# Altium project QCMI_SOM8MM.PrjPcb (part 1 of 3)
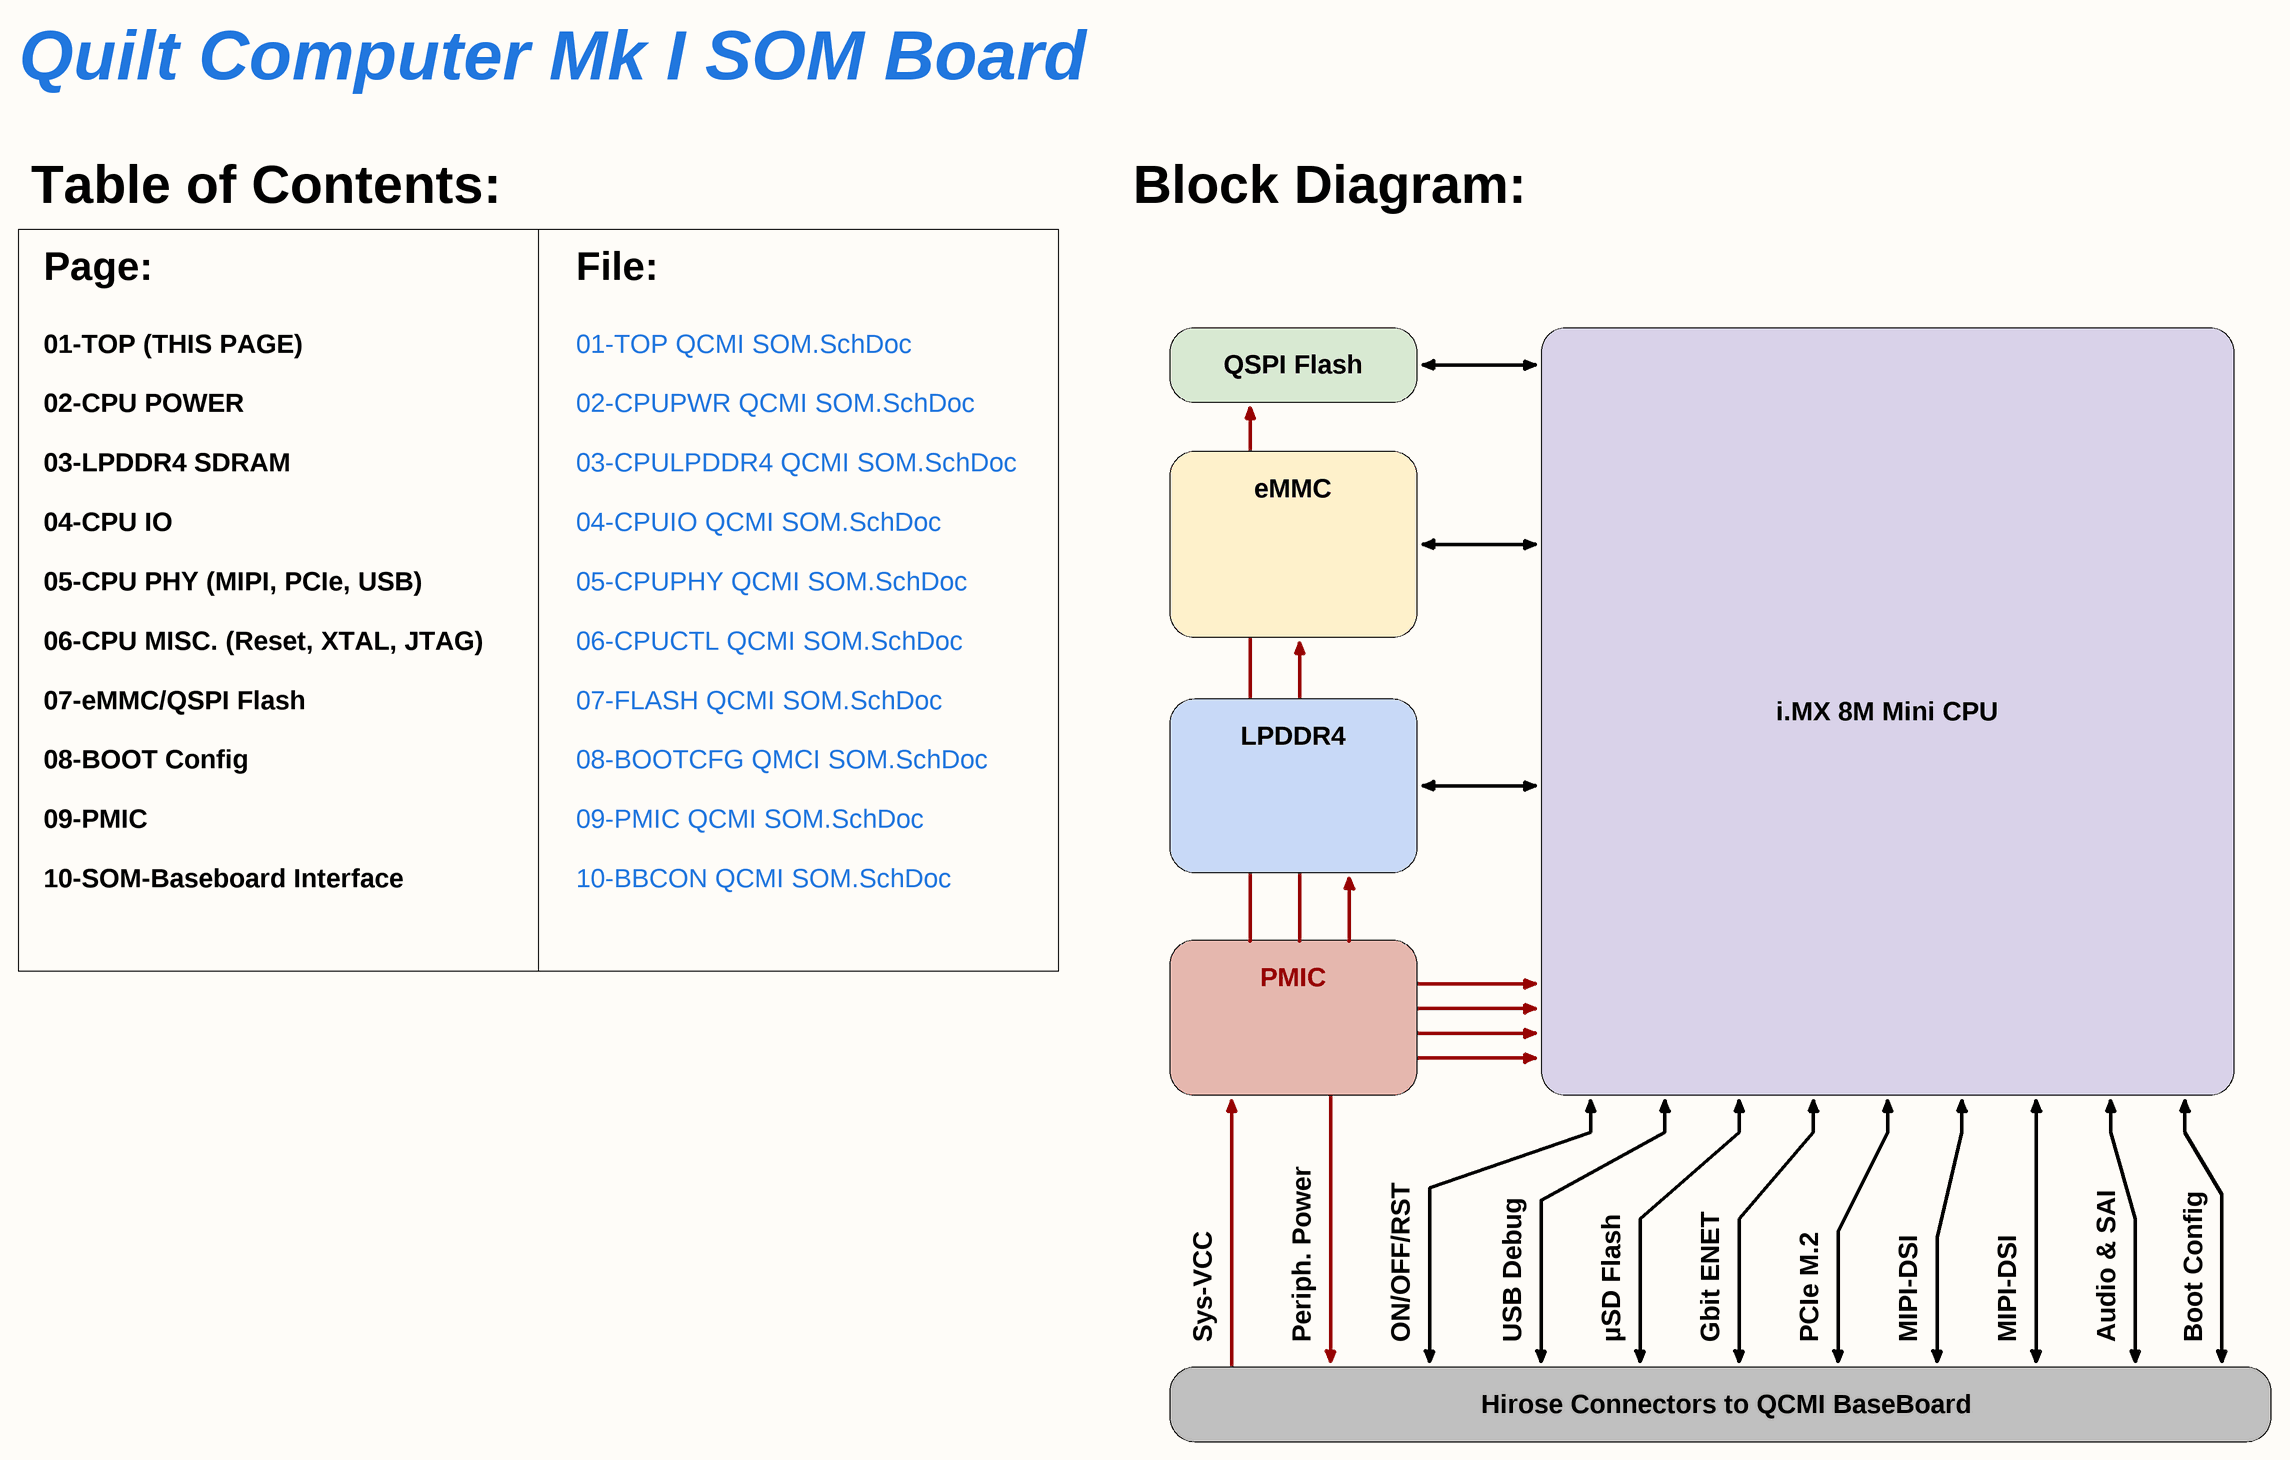
[diagram p0: 01-TOP QCMI SOM.SchDoc]
ProjectAddress1: 29315 Stonecrest Rd; ProjectAddress2: Rolling Hills Estates; ProjectAddress3: CA, 90275; ProjectAddress4: USA; ProjectApprover: S. Nesterenko; ProjectCAGE: 8LSW1; ProjectCompany: Allegro Labs, Inc.; ProjectDOC_NO_ASSY_DWG: TBD; ProjectDOC_NO_BOM: TBD; ProjectDOC_NO_FAB_DWG: TBD; ProjectDOC_NO_PCB_DWG: TBD; ProjectEngineer: B. Jordan; ProjectName: Quilt Computer Mk I SOM Board; ProjectNameShort: QCMISM; ProjectOrganization: QLTR; ProjectReviewer: D. Gudino; ProjectRevision: B
10 sheets, 227 parts. Net scope: global (net labels, ports and power ports of the same name join across sheets).
Board file: IMX8MMLPD4-CPU2_FULLY_PREPLACED_FANOUT.PcbDoc
Sheets:
  01-TOP QCMI SOM.SchDoc
  02-CPUPWR QCMI SOM.SchDoc
  03-CPULPDDR4 QCMI SOM.SchDoc
  04-CPUIO QCMI SOM.SchDoc
  05-CPUPHY QCMI SOM.SchDoc
  06-CPUCTL QCMI SOM.SchDoc
  07-FLASH QCMI SOM.SchDoc
  08-BOOTCFG QMCI SOM.SchDoc
  09-PMIC QCMI SOM.SchDoc
  10-BBCON QCMI SOM.SchDoc

## Sheet 01-TOP QCMI SOM.SchDoc: Title and Rev History
size 558 x 431 mm; CAGE_CODE: 8LSW1; Designer: B. Jordan; DsnPath: G:\My Drive\Quilter Computer - Engineering Assets\NXP i.MX8M-Mini\8MMINILPD4-CPU2-DESIGNFILES\8MMINILPD4-CPU2-DESIGNFILES\SCH-47712_A4.DSN; ApprovedBy: S. Nesterenko; CheckedBy: D. Gudino; Author: B. Jordan; CompanyName: Allegro Labs, Inc.; DrawnBy: B. Jordan; Engineer: B. Jordan; Address1: 29315 Stonecrest Rd; Address2: Rolling Hills Estates; Address3: CA, 90275; Address4: USA; DocumentNumber: QCMISM-SCH-01-0; Revision: 0; SheetNumber: 01; SheetTotal: 10; CHK_APP_DATE: --/--/--; DSN_APP_DATE: --/--/--; ENG_APP_DATE: --/--/--; DOC_NO_BOM: TBD; DOC_NO_ASSY_DWG: TBD; DOC_NO_FAB_DWG: TBD; DOC_NO_PCB_DWG: TBD

### Notes on the sheet
- Quilt Computer Mk I SOM Board
- Table of Contents:
- Block Diagram:
- Page:
- File:
- QSPI Flash
- eMMC
- LPDDR4
- i.MX 8M Mini CPU
- 01-TOP (THIS PAGE)
  02-CPU POWER
  03-LPDDR4 SDRAM
  04-CPU IO
  05-CPU PHY (MIPI, PCIe, USB)
  06-CPU MISC. (Reset, XTAL, JTAG)
  07-eMMC/QSPI Flash
  08-BOOT Config
  09-PMIC
  10-SOM-Baseboard Interface
- 01-TOP QCMI SOM.SchDoc
  02-CPUPWR QCMI SOM.SchDoc
  03-CPULPDDR4 QCMI SOM.SchDoc
  04-CPUIO QCMI SOM.SchDoc
  05-CPUPHY QCMI SOM.SchDoc
  06-CPUCTL QCMI SOM.SchDoc
  07-FLASH QCMI SOM.SchDoc
  08-BOOTCFG QMCI SOM.SchDoc
  09-PMIC QCMI SOM.SchDoc
  10-BBCON QCMI SOM.SchDoc
- PMIC
- Sys-VCC
- Periph. Power
- ON/OFF/RST
- USB Debug
- µSD Flash
- Gbit ENET
- PCIe M.2
- MIPI-DSI
- Audio & SAI
- Boot Config
- Hirose Connectors to QCMI BaseBoard
- DWG. NO.
- REV.
- SHT.
- REVISION
- DESCRIPTION
- DATE
- APPROVED
- ENG:
- DSN:
- APPROVALS
- PROJECT
- REFERENCE DOCUMENTS
- BOM:
- CHK:
- TITLE
- ASSY DWG:
- FAB DWG:
- PCB DWG:
- SIZE
- FILE NAME
- C
- SCHEMATIC DOCUMENT NUMBER
- SHEET
- OF
- REV

## Sheet 02-CPUPWR QCMI SOM.SchDoc: CPU PWR
size 558 x 431 mm; CAGE_CODE: 8LSW1; Designer: B. Jordan; DsnPath: G:\My Drive\Quilter Computer - Engineering Assets\NXP i.MX8M-Mini\8MMINILPD4-CPU2-DESIGNFILES\8MMINILPD4-CPU2-DESIGNFILES\SCH-47712_A4.DSN; ApprovedBy: S. Nesterenko; CheckedBy: D. Gudino; Author: B. Jordan; CompanyName: Allegro Labs, Inc.; DrawnBy: B. Jordan; Engineer: B. Jordan; Address1: 29315 Stonecrest Rd; Address2: Rolling Hills Estates; Address3: CA, 90275; Address4: USA; DocumentNumber: QCMISM-SCH-02-0; Revision: 0; SheetNumber: 02; SheetTotal: 10; CHK_APP_DATE: --/--/--; DSN_APP_DATE: --/--/--; ENG_APP_DATE: --/--/--; DOC_NO_BOM: TBD; DOC_NO_ASSY_DWG: TBD; DOC_NO_FAB_DWG: TBD; DOC_NO_PCB_DWG: TBD
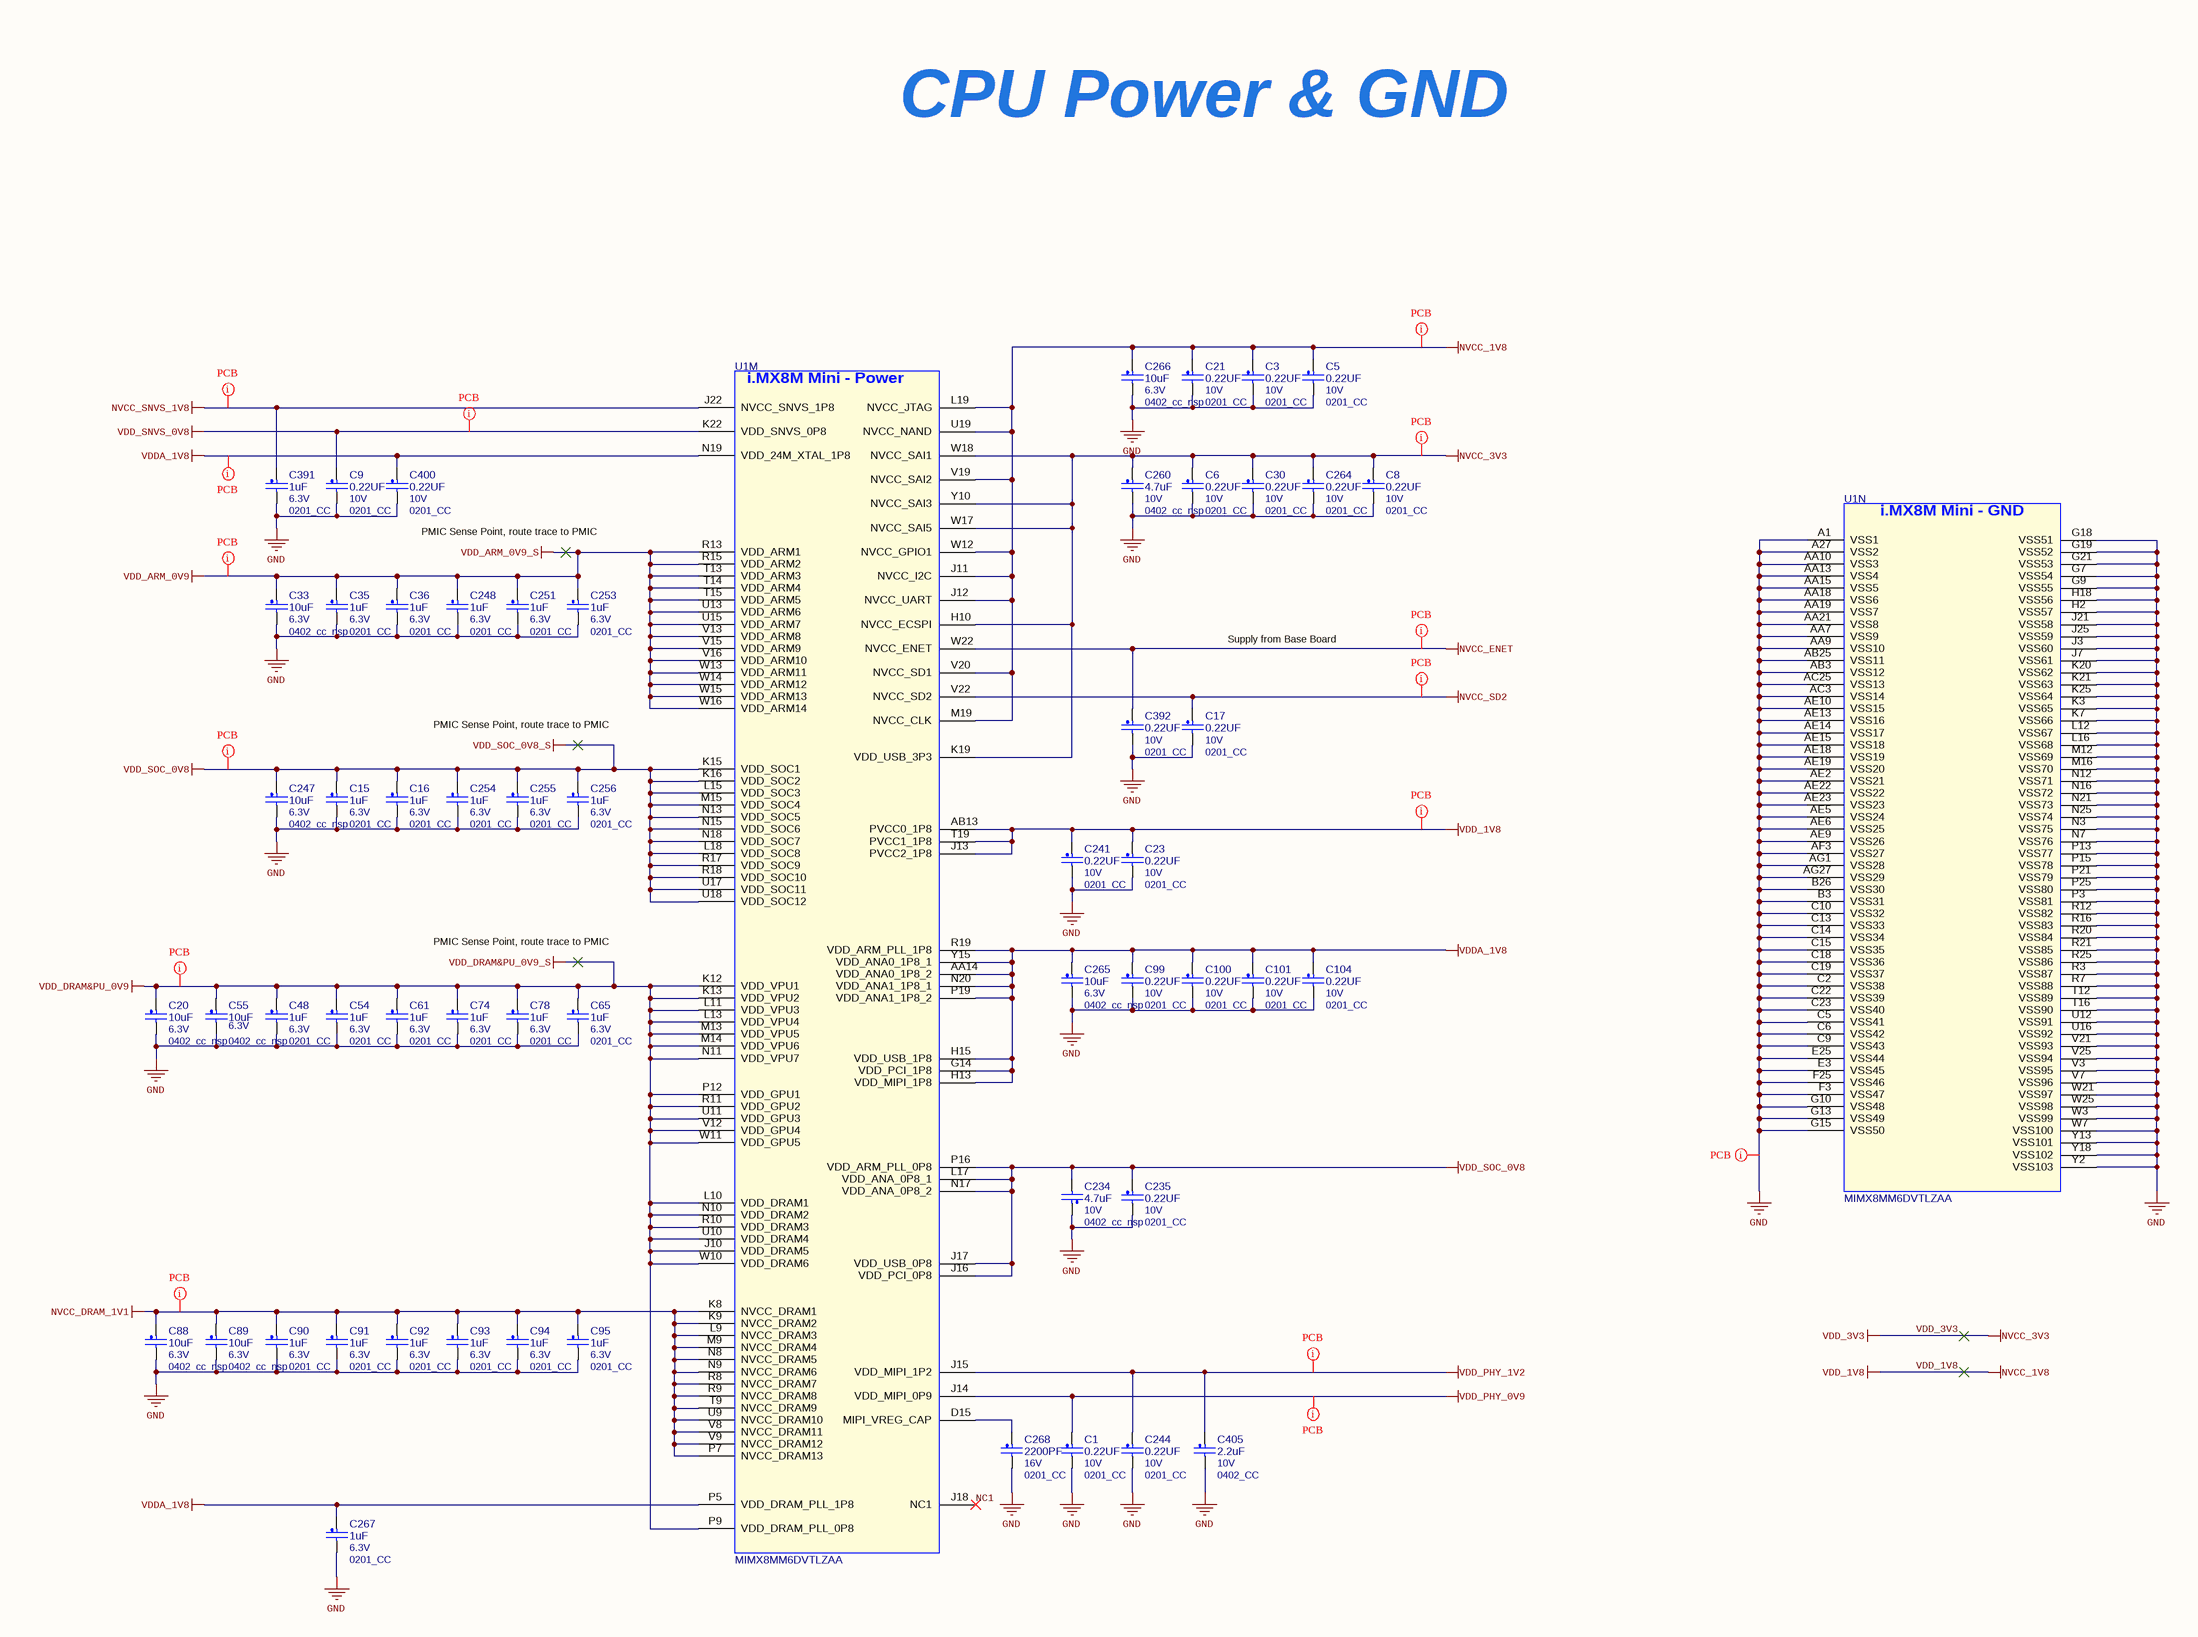
[diagram p1: 02-CPUPWR QCMI SOM.SchDoc]

### Parts
C1  0.22UF  VOLTAGE: 10V  [0201_CC]
C3  0.22UF  VOLTAGE: 10V  [0201_CC]
C5  0.22UF  VOLTAGE: 10V  [0201_CC]
C6  0.22UF  VOLTAGE: 10V  [0201_CC]
C8  0.22UF  VOLTAGE: 10V  [0201_CC]
C9  0.22UF  VOLTAGE: 10V  [0201_CC]
C15  1uF  VOLTAGE: 6.3V  [0201_CC]
C16  1uF  VOLTAGE: 6.3V  [0201_CC]
C17  0.22UF  VOLTAGE: 10V  [0201_CC]
C20  10uF  VOLTAGE: 6.3V  [0402_cc_nsp]
C21  0.22UF  VOLTAGE: 10V  [0201_CC]
C23  0.22UF  VOLTAGE: 10V  [0201_CC]
C30  0.22UF  VOLTAGE: 10V  [0201_CC]
C33  10uF  VOLTAGE: 6.3V  [0402_cc_nsp]
C35  1uF  VOLTAGE: 6.3V  [0201_CC]
C36  1uF  VOLTAGE: 6.3V  [0201_CC]
C48  1uF  VOLTAGE: 6.3V  [0201_CC]
C54  1uF  VOLTAGE: 6.3V  [0201_CC]
C55  10uF  VOLTAGE: 6.3V  [0402_cc_nsp]
C61  1uF  VOLTAGE: 6.3V  [0201_CC]
C65  1uF  VOLTAGE: 6.3V  [0201_CC]
C74  1uF  VOLTAGE: 6.3V  [0201_CC]
C78  1uF  VOLTAGE: 6.3V  [0201_CC]
C88  10uF  VOLTAGE: 6.3V  [0402_cc_nsp]
C89  10uF  VOLTAGE: 6.3V  [0402_cc_nsp]
C90  1uF  VOLTAGE: 6.3V  [0201_CC]
C91  1uF  VOLTAGE: 6.3V  [0201_CC]
C92  1uF  VOLTAGE: 6.3V  [0201_CC]
C93  1uF  VOLTAGE: 6.3V  [0201_CC]
C94  1uF  VOLTAGE: 6.3V  [0201_CC]
C95  1uF  VOLTAGE: 6.3V  [0201_CC]
C99  0.22UF  VOLTAGE: 10V  [0201_CC]
C100  0.22UF  VOLTAGE: 10V  [0201_CC]
C101  0.22UF  VOLTAGE: 10V  [0201_CC]
C104  0.22UF  VOLTAGE: 10V  [0201_CC]
C234  4.7uF  VOLTAGE: 10V  [0402_cc_nsp]
C235  0.22UF  VOLTAGE: 10V  [0201_CC]
C241  0.22UF  VOLTAGE: 10V  [0201_CC]
C244  0.22UF  VOLTAGE: 10V  [0201_CC]
C247  10uF  VOLTAGE: 6.3V  [0402_cc_nsp]
C248  1uF  VOLTAGE: 6.3V  [0201_CC]
C251  1uF  VOLTAGE: 6.3V  [0201_CC]
C253  1uF  VOLTAGE: 6.3V  [0201_CC]
C254  1uF  VOLTAGE: 6.3V  [0201_CC]
C255  1uF  VOLTAGE: 6.3V  [0201_CC]
C256  1uF  VOLTAGE: 6.3V  [0201_CC]
C260  4.7uF  VOLTAGE: 10V  [0402_cc_nsp]
C264  0.22UF  VOLTAGE: 10V  [0201_CC]
C265  10uF  VOLTAGE: 6.3V  [0402_cc_nsp]
C266  10uF  VOLTAGE: 6.3V  [0402_cc_nsp]
C267  1uF  VOLTAGE: 6.3V  [0201_CC]
C268  2200PF  VOLTAGE: 16V  [0201_CC]
C391  1uF  VOLTAGE: 6.3V  [0201_CC]
C392  0.22UF  VOLTAGE: 10V  [0201_CC]
C400  0.22UF  VOLTAGE: 10V  [0201_CC]
C405  2.2uF  VOLTAGE: 10V  [0402_CC]
U1  MIMX8MM6DVTLZAA  [bga486_0p5_14x14]  (parts M,N of 14)

### Nets
GND: C1.2 C3.2 C5.2 C6.2 C8.2 C9.2 C15.2 C16.2 C17.2 C20.2 C21.2 C23.2 C30.2 C33.2 C35.2 C36.2 C48.2 C54.2 C55.2 C61.2 C65.2 C74.2 C78.2 C88.2 C89.2 C90.2 C91.2 C92.2 C93.2 C94.2 C95.2 C99.2 C100.2 C101.2 C104.2 C234.1 C235.2 C241.2 C244.2 C247.2 C248.2 C251.2 C253.2 C254.2 C255.2 C256.2 C260.2 C264.2 C265.2 C266.2 C267.2 C268.2 C391.2 C392.2 C400.2 C405.2 U1.A1(VSS1) U1.A27(VSS2) U1.AA7(VSS9) U1.AA9(VSS10) U1.AA10(VSS3) U1.AA13(VSS4) U1.AA15(VSS5) U1.AA18(VSS6) U1.AA19(VSS7) U1.AA21(VSS8) U1.AB3(VSS12) U1.AB25(VSS11) U1.AC3(VSS14) U1.AC25(VSS13) U1.AE2(VSS21) U1.AE5(VSS24) U1.AE6(VSS25) U1.AE9(VSS26) U1.AE10(VSS15) U1.AE13(VSS16) U1.AE14(VSS17) U1.AE15(VSS18) U1.AE18(VSS19) U1.AE19(VSS20) U1.AE22(VSS22) U1.AE23(VSS23) U1.AF3(VSS27) U1.AG1(VSS28) U1.AG27(VSS29) U1.B3(VSS31) U1.B26(VSS30) U1.C2(VSS38) U1.C5(VSS41) U1.C6(VSS42) U1.C9(VSS43) U1.C10(VSS32) U1.C13(VSS33) U1.C14(VSS34) U1.C15(VSS35) U1.C18(VSS36) U1.C19(VSS37) U1.C22(VSS39) U1.C23(VSS40) U1.E3(VSS45) U1.E25(VSS44) U1.F3(VSS47) U1.F25(VSS46) U1.G7(VSS54) U1.G9(VSS55) U1.G10(VSS48) U1.G13(VSS49) U1.G15(VSS50) U1.G18(VSS51) U1.G19(VSS52) U1.G21(VSS53) U1.H2(VSS57) U1.H18(VSS56) U1.J3(VSS60) U1.J7(VSS61) U1.J21(VSS58) U1.J25(VSS59) U1.K3(VSS65) U1.K7(VSS66) U1.K20(VSS62) U1.K21(VSS63) U1.K25(VSS64) U1.L12(VSS67) U1.L16(VSS68) U1.M12(VSS69) U1.M16(VSS70) U1.N3(VSS75) U1.N7(VSS76) U1.N12(VSS71) U1.N16(VSS72) U1.N21(VSS73) U1.N25(VSS74) U1.P3(VSS81) U1.P13(VSS77) U1.P15(VSS78) U1.P21(VSS79) U1.P25(VSS80) U1.R3(VSS87) U1.R7(VSS88) U1.R12(VSS82) U1.R16(VSS83) U1.R20(VSS84) U1.R21(VSS85) U1.R25(VSS86) U1.T12(VSS89) U1.T16(VSS90) U1.U12(VSS91) U1.U16(VSS92) U1.V3(VSS95) U1.V7(VSS96) U1.V21(VSS93) U1.V25(VSS94) U1.W3(VSS99) U1.W7(VSS100) U1.W21(VSS97) U1.W25(VSS98) U1.Y2(VSS103) U1.Y13(VSS101) U1.Y18(VSS102)
NVCC_DRAM_1V1: C88.1 C89.1 C90.1 C91.1 C92.1 C93.1 C94.1 C95.1 U1.K8(NVCC_DRAM1) U1.K9(NVCC_DRAM2) U1.L9(NVCC_DRAM3) U1.M9(NVCC_DRAM4) U1.N8(NVCC_DRAM5) U1.N9(NVCC_DRAM6) U1.P7(NVCC_DRAM13) U1.R8(NVCC_DRAM7) U1.R9(NVCC_DRAM8) U1.T9(NVCC_DRAM9) U1.U9(NVCC_DRAM10) U1.V8(NVCC_DRAM11) U1.V9(NVCC_DRAM12)
NVCC_ENET: C392.1 U1.W22(NVCC_ENET)
NVCC_SD2: C17.1 U1.V22(NVCC_SD2)
NVCC_SNVS_1V8: C391.1 U1.J22(NVCC_SNVS_1P8)
VDD_1V8: C3.1 C5.1 C21.1 C23.1 C241.1 C266.1 U1.AB13(PVCC0_1P8) U1.J11(NVCC_I2C) U1.J12(NVCC_UART) U1.J13(PVCC2_1P8) U1.L19(NVCC_JTAG) U1.M19(NVCC_CLK) U1.T19(PVCC1_1P8) U1.U19(NVCC_NAND) U1.V19(NVCC_SAI2) U1.V20(NVCC_SD1) U1.W12(NVCC_GPIO1)  [also labelled NVCC_1V8]
VDD_3V3: C6.1 C8.1 C30.1 C260.1 C264.1 U1.H10(NVCC_ECSPI) U1.K19(VDD_USB_3P3) U1.W17(NVCC_SAI5) U1.W18(NVCC_SAI1) U1.Y10(NVCC_SAI3)  [also labelled NVCC_3V3]
VDD_ARM_0V9: C33.1 C35.1 C36.1 C248.1 C251.1 C253.1 U1.R13(VDD_ARM1) U1.R15(VDD_ARM2) U1.T13(VDD_ARM3) U1.T14(VDD_ARM4) U1.T15(VDD_ARM5) U1.U13(VDD_ARM6) U1.U15(VDD_ARM7) U1.V13(VDD_ARM8) U1.V15(VDD_ARM9) U1.V16(VDD_ARM10) U1.W13(VDD_ARM11) U1.W14(VDD_ARM12) U1.W15(VDD_ARM13) U1.W16(VDD_ARM14)  [also labelled VDD_ARM_0V9_S]
VDD_DRAM&PU_0V9: C20.1 C48.1 C54.1 C55.1 C61.1 C65.1 C74.1 C78.1 U1.J10(VDD_DRAM5) U1.K12(VDD_VPU1) U1.K13(VDD_VPU2) U1.L10(VDD_DRAM1) U1.L11(VDD_VPU3) U1.L13(VDD_VPU4) U1.M13(VDD_VPU5) U1.M14(VDD_VPU6) U1.N10(VDD_DRAM2) U1.N11(VDD_VPU7) U1.P9(VDD_DRAM_PLL_0P8) U1.P12(VDD_GPU1) U1.R10(VDD_DRAM3) U1.R11(VDD_GPU2) U1.U10(VDD_DRAM4) U1.U11(VDD_GPU3) U1.V12(VDD_GPU4) U1.W10(VDD_DRAM6) U1.W11(VDD_GPU5)  [also labelled VDD_DRAM&PU_0V9_S]
VDD_PHY_0V9: C1.1 U1.J14(VDD_MIPI_0P9)
VDD_PHY_1V2: C244.1 C405.1 U1.J15(VDD_MIPI_1P2)
VDD_SNVS_0V8: C9.1 U1.K22(VDD_SNVS_0P8)
VDD_SOC_0V8: C15.1 C16.1 C234.2 C235.1 C247.1 C254.1 C255.1 C256.1 U1.J16(VDD_PCI_0P8) U1.J17(VDD_USB_0P8) U1.K15(VDD_SOC1) U1.K16(VDD_SOC2) U1.L15(VDD_SOC3) U1.L17(VDD_ANA_0P8_1) U1.L18(VDD_SOC8) U1.M15(VDD_SOC4) U1.N13(VDD_SOC5) U1.N15(VDD_SOC6) U1.N17(VDD_ANA_0P8_2) U1.N18(VDD_SOC7) U1.P16(VDD_ARM_PLL_0P8) U1.R17(VDD_SOC9) U1.R18(VDD_SOC10) U1.U17(VDD_SOC11) U1.U18(VDD_SOC12)  [also labelled VDD_SOC_0V8_S]
VDDA_1V8: C99.1 C100.1 C101.1 C104.1 C265.1 C267.1 C400.1 U1.AA14(VDD_ANA0_1P8_2) U1.G14(VDD_PCI_1P8) U1.H13(VDD_MIPI_1P8) U1.H15(VDD_USB_1P8) U1.N19(VDD_24M_XTAL_1P8) U1.N20(VDD_ANA1_1P8_1) U1.P5(VDD_DRAM_PLL_1P8) U1.P19(VDD_ANA1_1P8_2) U1.R19(VDD_ARM_PLL_1P8) U1.Y15(VDD_ANA0_1P8_1)
NC1: U1.J18(NC1)
NetC268_1: C268.1 U1.D15(MIPI_VREG_CAP)

### Layout directives
rule Supply Nets [Voltage = 1.800]; net class POWER: NVCC_SNVS_1V8, VDD_1V8, VDDA_1V8
rule Supply Nets [Voltage = 800.0m]; net class POWER: VDD_SNVS_0V8, VDD_SOC_0V8
rule Supply Nets [Voltage = 900.0m]; net class POWER: VDD_ARM_0V9, VDD_DRAM&PU_0V9, VDD_PHY_0V9
rule Supply Nets [Voltage = 1.100]; net class POWER: NVCC_DRAM_1V1
rule Supply Nets [Voltage = 1.200]; net class POWER: VDD_PHY_1V2
rule Supply Nets [Voltage = 3.300]; net class POWER: NVCC_ENET, NVCC_SD2, VDD_3V3
mark named PCB: VDD_1V8
rule Supply Nets [Voltage = 0.000]; net class POWER: GND

### Notes on the sheet
- CPU Power & GND
- PMIC Sense Point, route trace to PMIC
- Supply from Base Board
- DWG. NO.
- REV.
- SHT.
- REVISION
- DESCRIPTION
- DATE
- APPROVED
- ENG:
- DSN:
- APPROVALS
- PROJECT
- REFERENCE DOCUMENTS
- BOM:
- CHK:
- TITLE
- ASSY DWG:
- FAB DWG:
- PCB DWG:
- SIZE
- FILE NAME
- C
- SCHEMATIC DOCUMENT NUMBER
- SHEET
- OF
- REV
- (in symbol MIMX8MM_BGA486P, part M) i.MX8M Mini - Power
- (in symbol MIMX8MM_BGA486P, part N) i.MX8M Mini - GND

### Library data of the parts
C1 C3 C9 C17 C100 C104 C235 C400 = CAP_NP: CAP CER 0.22UF 10V 20% X5R 0201; MFG_PN01: LMK063BJ224MP-F; MFG_NAME01: Taiyo Yuden; EIA Case: 0201; Temp Range: -55°C ~ 125°C; Value: 0.22UF; PCB Footprint: 0201_CC; ROHS: Yes; Tolerance: 20%
C5 C6 C8 C21 C23 C30 C99 C101 C241 C244 C264 C392 = CAP_NP: CAP CER 0.22UF 10V 20% X5R 0201; MFG_NAME01: Taiyo Yuden; MFG_PN01: LMK063BJ224MP-F; EIA Case: 0201; Temp Range: -55°C ~ 125°C; Value: 0.22UF; Tolerance: 20%; ROHS: Yes; PCB Footprint: 0201_CC
C15 C16 C35 C36 C48 C61 C65 C78 C90-C92 C95 C248 C251 C253 C254 C256 C391 = CAP_NP: CAP CER 1uF 6.3V 20% X5R 0201; Temp Range: -55°C ~ 125°C; EIA Case: 0201; MFG_PN01: 02016D105MAT2A; MFG_NAME01: AVX; Value: 1uF; ROHS: Yes; Tolerance: 20%; PCB Footprint: 0201_CC
C20 C88 C247 = CAP_NP: CAP CER 10UF 6.3V 20% X5R 0402; Temp Range: -55°C ~ 125°C; EIA Case: 0402; MFG_NAME01: SAMSUNG ELECTRO MECHANICS; MFG_PN01: CL05A106MQ5NUNC; Value: 10uF; PCB Footprint: 0402_cc_nsp; Tolerance: 20%; ROHS: Yes
C33 C55 C89 C265 C266 = CAP_NP: CAP CER 10UF 6.3V 20% X5R 0402; Temp Range: -55°C ~ 125°C; EIA Case: 0402; MFG_PN01: CL05A106MQ5NUNC; MFG_NAME01: SAMSUNG ELECTRO MECHANICS; Value: 10uF; PCB Footprint: 0402_cc_nsp; ROHS: Yes; Tolerance: 20%
C54 C74 C93 C94 C255 C267 = CAP_NP: CAP CER 1uF 6.3V 20% X5R 0201; Temp Range: -55°C ~ 125°C; EIA Case: 0201; MFG_NAME01: AVX; MFG_PN01: 02016D105MAT2A; Value: 1uF; PCB Footprint: 0201_CC; Tolerance: 20%; ROHS: Yes
C234 = CAP_NP: CAP CER 4.7uF 10V 10% X5R 0402; MFG_PN01: CL05A475KP5NRNC; MFG_NAME01: SAMSUNG ELECTRO MECHANICS; EIA Case: 0402; Temp Range: -55°C ~ 125°C; Value: 4.7uF; PCB Footprint: 0402_cc_nsp; ROHS: Yes; Tolerance: 10%
C260 = CAP_NP: CAP CER 4.7uF 10V 10% X5R 0402; Temp Range: -55°C ~ 125°C; EIA Case: 0402; MFG_PN01: CL05A475KP5NRNC; MFG_NAME01: SAMSUNG ELECTRO MECHANICS; Value: 4.7uF; PCB Footprint: 0402_cc_nsp; ROHS: Yes; Tolerance: 10%
C268 = CAP_NP: CAP CER 2200PF 16V 10% X7R 0201; MFG_PN01: GRM033R71C222KA88D; MFG_NAME01: MURATA; Tolerance: 20%; EIA Case: 0201; Temp Range: -55°C ~ 125°C; Value: 2200PF; ROHS: Yes; PCB Footprint: 0201_CC
C405 = CAP_NP: CAP CER 2.2uF 10V 10% X5R 0402; Temp Range: -55°C ~ 125°C; EIA Case: 0402; MFG_PN01: C1005X5R1A225K; MFG_NAME01: TDK; Value: 2.2uF; ROHS: Yes; Tolerance: 10%; PCB Footprint: 0402_CC
U1 = MIMX8MM_BGA486P: IC CPU QUAD CORTEX A53+M4 1.8GHZ BGA486; MFG_NAME01: NXP SEMICONDUCTORS; Value: MIMX8MM6DVTLZAA; MFG_PN01: MIMX8MM6DVTLZAA; ROHS: Yes; PCB Footprint: bga486_0p5_14x14; JEDEC Case: BGA486

## Sheet 03-CPULPDDR4 QCMI SOM.SchDoc: LPDDR4
size 558 x 431 mm; CAGE_CODE: 8LSW1; Designer: B. Jordan; DsnPath: G:\My Drive\Quilter Computer - Engineering Assets\NXP i.MX8M-Mini\8MMINILPD4-CPU2-DESIGNFILES\8MMINILPD4-CPU2-DESIGNFILES\SCH-47712_A4.DSN; ApprovedBy: S. Nesterenko; CheckedBy: D. Gudino; Author: B. Jordan; CompanyName: Allegro Labs, Inc.; DrawnBy: B. Jordan; Engineer: B. Jordan; Address1: 29315 Stonecrest Rd; Address2: Rolling Hills Estates; Address3: CA, 90275; Address4: USA; DocumentNumber: QCMISM-SCH-03-0; Revision: 0; SheetNumber: 03; SheetTotal: 10; CHK_APP_DATE: --/--/--; DSN_APP_DATE: --/--/--; ENG_APP_DATE: --/--/--; DOC_NO_BOM: TBD; DOC_NO_ASSY_DWG: TBD; DOC_NO_FAB_DWG: TBD; DOC_NO_PCB_DWG: TBD
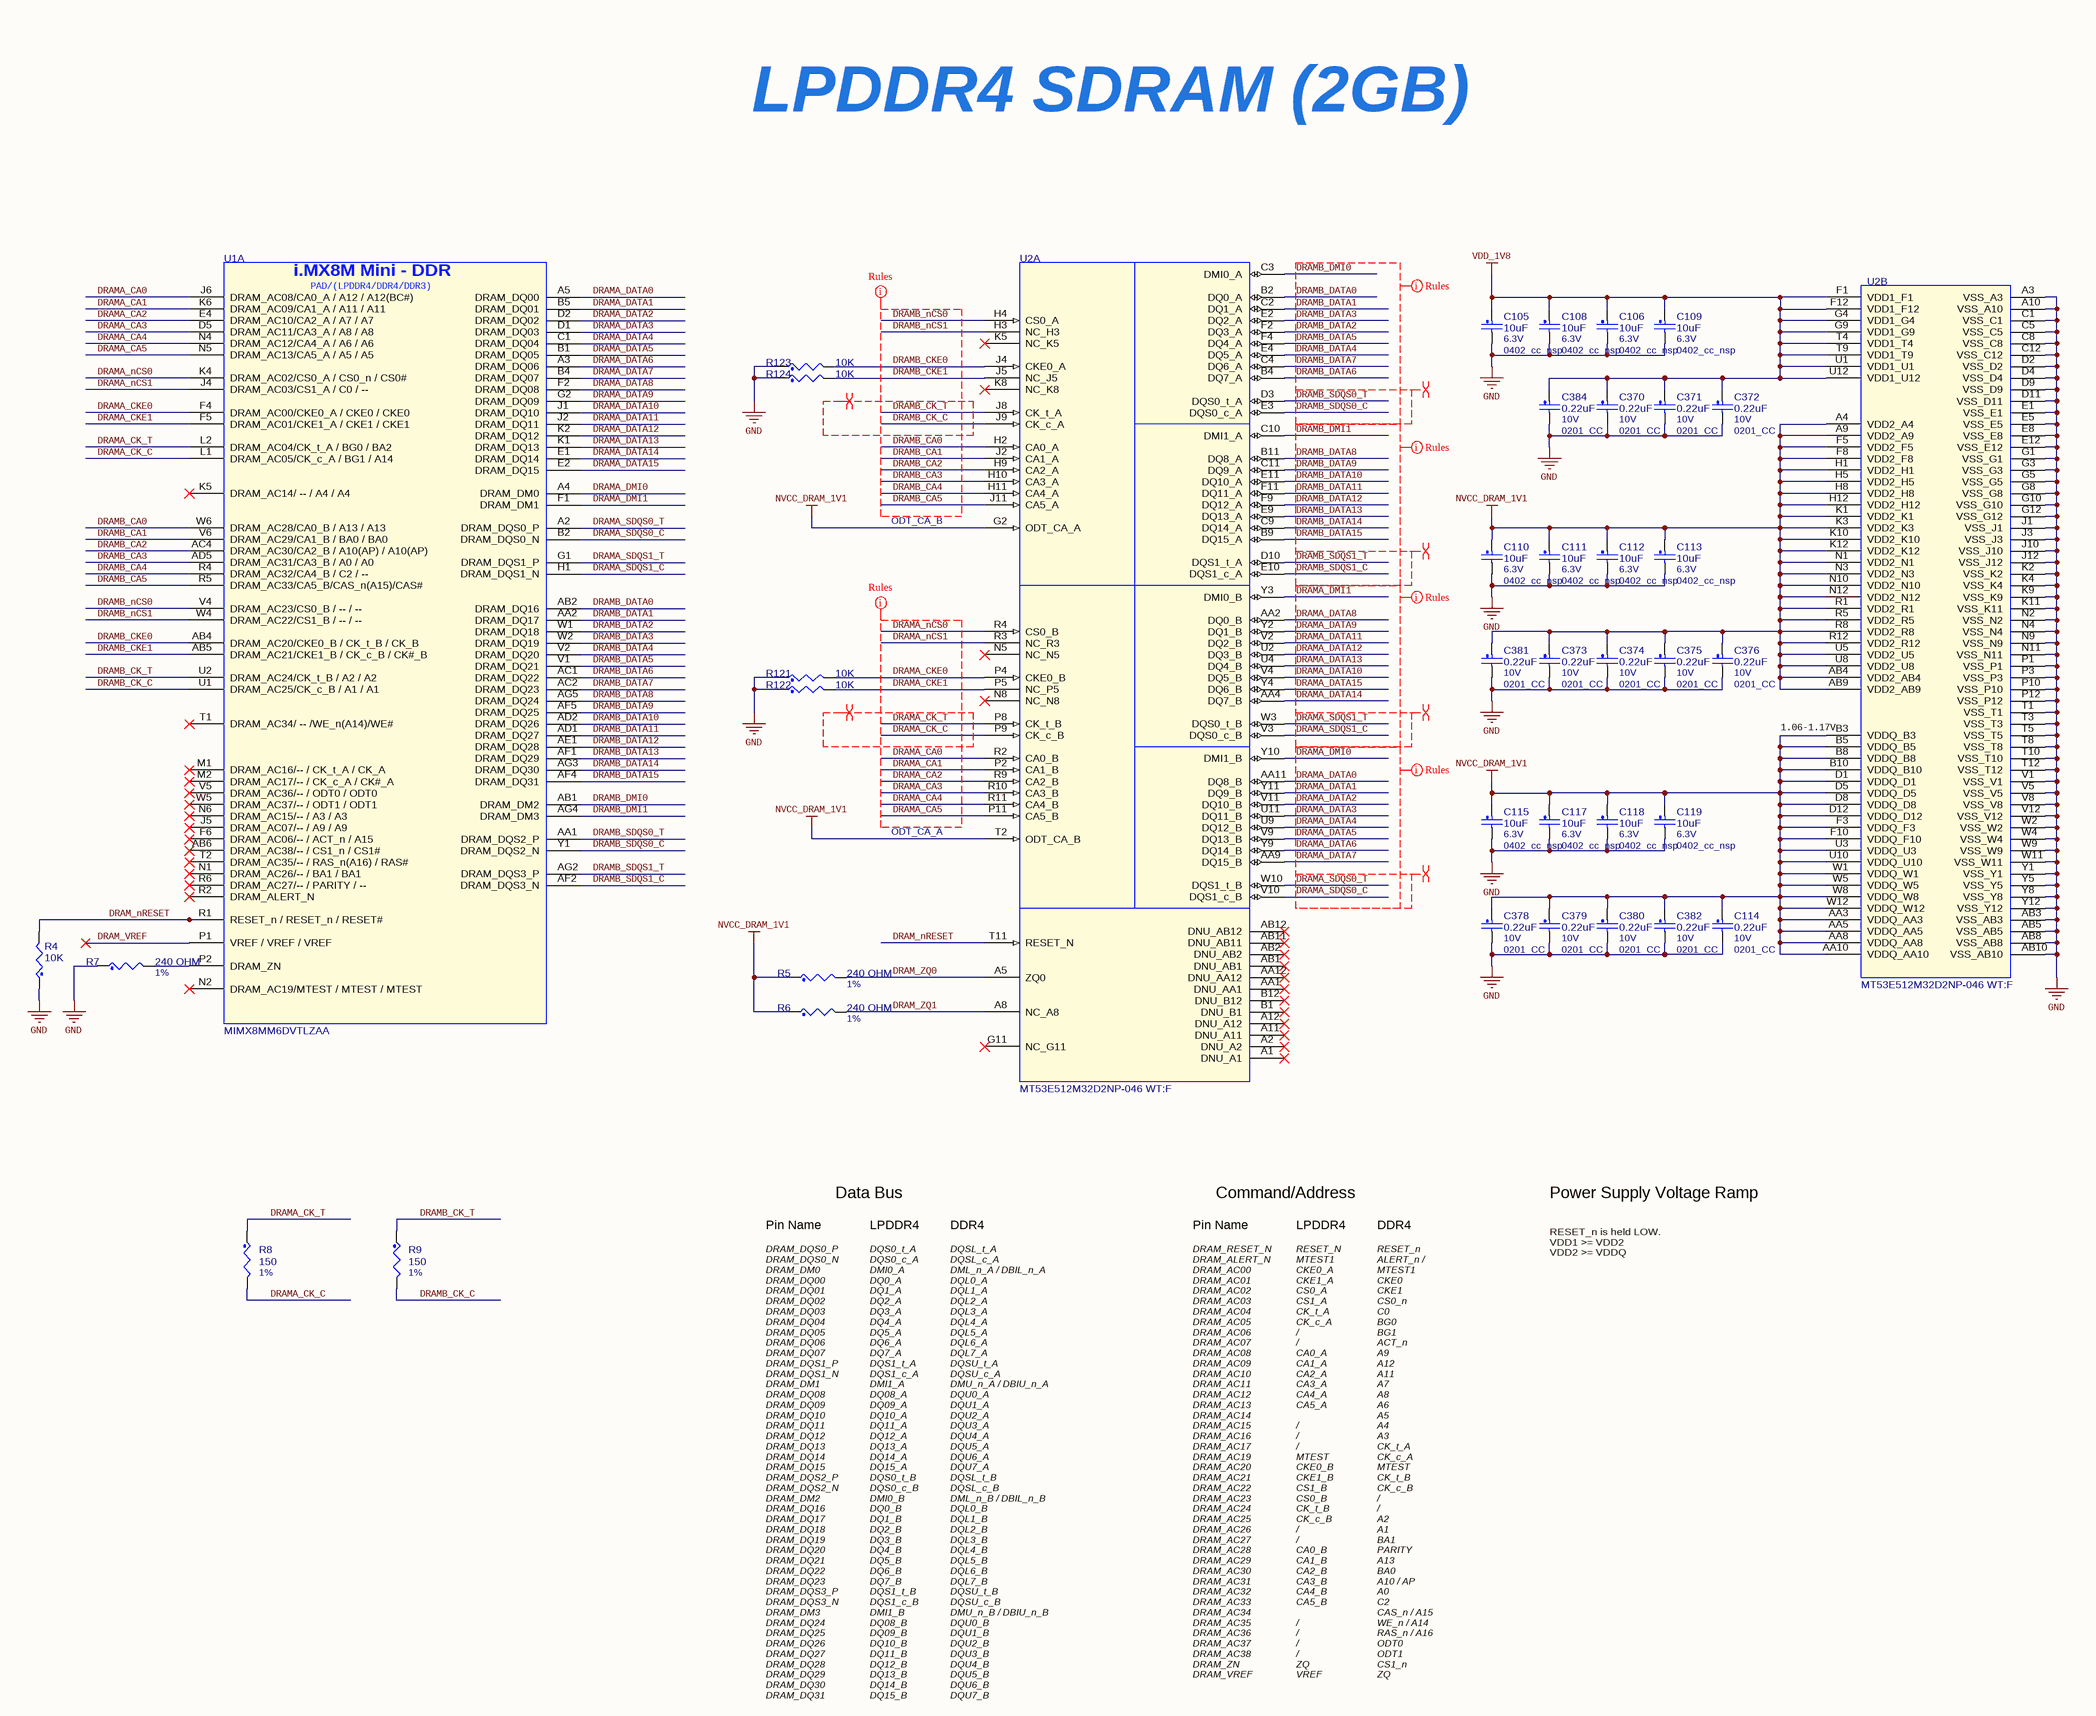
[diagram p2: 03-CPULPDDR4 QCMI SOM.SchDoc]

### Parts
C105  10uF  VOLTAGE: 6.3V  [0402_cc_nsp]
C106  10uF  VOLTAGE: 6.3V  [0402_cc_nsp]
C108  10uF  VOLTAGE: 6.3V  [0402_cc_nsp]
C109  10uF  VOLTAGE: 6.3V  [0402_cc_nsp]
C110  10uF  VOLTAGE: 6.3V  [0402_cc_nsp]
C111  10uF  VOLTAGE: 6.3V  [0402_cc_nsp]
C112  10uF  VOLTAGE: 6.3V  [0402_cc_nsp]
C113  10uF  VOLTAGE: 6.3V  [0402_cc_nsp]
C114  0.22uF  VOLTAGE: 10V  [0201_CC]
C115  10uF  VOLTAGE: 6.3V  [0402_cc_nsp]
C117  10uF  VOLTAGE: 6.3V  [0402_cc_nsp]
C118  10uF  VOLTAGE: 6.3V  [0402_cc_nsp]
C119  10uF  VOLTAGE: 6.3V  [0402_cc_nsp]
C370  0.22uF  VOLTAGE: 10V  [0201_CC]
C371  0.22uF  VOLTAGE: 10V  [0201_CC]
C372  0.22uF  VOLTAGE: 10V  [0201_CC]
C373  0.22uF  VOLTAGE: 10V  [0201_CC]
C374  0.22uF  VOLTAGE: 10V  [0201_CC]
C375  0.22uF  VOLTAGE: 10V  [0201_CC]
C376  0.22uF  VOLTAGE: 10V  [0201_CC]
C378  0.22uF  VOLTAGE: 10V  [0201_CC]
C379  0.22uF  VOLTAGE: 10V  [0201_CC]
C380  0.22uF  VOLTAGE: 10V  [0201_CC]
C381  0.22uF  VOLTAGE: 10V  [0201_CC]
C382  0.22uF  VOLTAGE: 10V  [0201_CC]
C384  0.22uF  VOLTAGE: 10V  [0201_CC]
R4  10K  [0201_CC]
R5  240 OHM  Tolerance: 1%  [0201_CC]
R6  240 OHM  Tolerance: 1%  [0201_CC]
R7  240 OHM  Tolerance: 1%  [0201_CC]
R8  150  Tolerance: 1%  [0402_CC]
R9  150  Tolerance: 1%  [0402_CC]
R121  10K  [0201_CC]
R122  10K  [0201_CC]
R123  10K  [0201_CC]
R124  10K  [0201_CC]
U1  MIMX8MM6DVTLZAA  [bga486_0p5_14x14]  (part A of 14)
U2  MT53E512M32D2NP-046 WT:F  [bga200_0p65x0p8_10p1x14p6]  (parts A,B of 2)

### Nets
GND: C105.2 C106.2 C108.2 C109.2 C110.2 C111.2 C112.2 C113.2 C114.2 C115.2 C117.2 C118.2 C119.2 C370.2 C371.2 C372.2 C373.2 C374.2 C375.2 C376.2 C378.2 C379.2 C380.2 C381.2 C382.2 C384.2 R4.1 R7.1 R121.1 R122.1 R123.1 R124.1 U2.A3(VSS_A3) U2.A10(VSS_A10) U2.AB3(VSS_AB3) U2.AB5(VSS_AB5) U2.AB8(VSS_AB8) U2.AB10(VSS_AB10) U2.C1(VSS_C1) U2.C5(VSS_C5) U2.C8(VSS_C8) U2.C12(VSS_C12) U2.D2(VSS_D2) U2.D4(VSS_D4) U2.D9(VSS_D9) U2.D11(VSS_D11) U2.E1(VSS_E1) U2.E5(VSS_E5) U2.E8(VSS_E8) U2.E12(VSS_E12) U2.G1(VSS_G1) U2.G3(VSS_G3) U2.G5(VSS_G5) U2.G8(VSS_G8) U2.G10(VSS_G10) U2.G12(VSS_G12) U2.J1(VSS_J1) U2.J3(VSS_J3) U2.J10(VSS_J10) U2.J12(VSS_J12) U2.K2(VSS_K2) U2.K4(VSS_K4) U2.K9(VSS_K9) U2.K11(VSS_K11) U2.N2(VSS_N2) U2.N4(VSS_N4) U2.N9(VSS_N9) U2.N11(VSS_N11) U2.P1(VSS_P1) U2.P3(VSS_P3) U2.P10(VSS_P10) U2.P12(VSS_P12) U2.T1(VSS_T1) U2.T3(VSS_T3) U2.T5(VSS_T5) U2.T8(VSS_T8) U2.T10(VSS_T10) U2.T12(VSS_T12) U2.V1(VSS_V1) U2.V5(VSS_V5) U2.V8(VSS_V8) U2.V12(VSS_V12) U2.W2(VSS_W2) U2.W4(VSS_W4) U2.W9(VSS_W9) U2.W11(VSS_W11) U2.Y1(VSS_Y1) U2.Y5(VSS_Y5) U2.Y8(VSS_Y8) U2.Y12(VSS_Y12)
NVCC_DRAM_1V1: C110.1 C111.1 C112.1 C113.1 C114.1 C115.1 C117.1 C118.1 C119.1 C373.1 C374.1 C375.1 C376.1 C378.1 C379.1 C380.1 C381.1 C382.1 R5.1 R6.1 U2.A4(VDD2_A4) U2.A9(VDD2_A9) U2.AA3(VDDQ_AA3) U2.AA5(VDDQ_AA5) U2.AA8(VDDQ_AA8) U2.AA10(VDDQ_AA10) U2.AB4(VDD2_AB4) U2.AB9(VDD2_AB9) U2.B3(VDDQ_B3) U2.B5(VDDQ_B5) U2.B8(VDDQ_B8) U2.B10(VDDQ_B10) U2.D1(VDDQ_D1) U2.D5(VDDQ_D5) U2.D8(VDDQ_D8) U2.D12(VDDQ_D12) U2.F3(VDDQ_F3) U2.F5(VDD2_F5) U2.F8(VDD2_F8) U2.F10(VDDQ_F10) U2.G2(ODT_CA_A) U2.H1(VDD2_H1) U2.H5(VDD2_H5) U2.H8(VDD2_H8) U2.H12(VDD2_H12) U2.K1(VDD2_K1) U2.K3(VDD2_K3) U2.K10(VDD2_K10) U2.K12(VDD2_K12) U2.N1(VDD2_N1) U2.N3(VDD2_N3) U2.N10(VDD2_N10) U2.N12(VDD2_N12) U2.R1(VDD2_R1) U2.R5(VDD2_R5) U2.R8(VDD2_R8) U2.R12(VDD2_R12) U2.T2(ODT_CA_B) U2.U3(VDDQ_U3) U2.U5(VDD2_U5) U2.U8(VDD2_U8) U2.U10(VDDQ_U10) U2.W1(VDDQ_W1) U2.W5(VDDQ_W5) U2.W8(VDDQ_W8) U2.W12(VDDQ_W12)
VDD_1V8: C105.1 C106.1 C108.1 C109.1 C370.1 C371.1 C372.1 C384.1 U2.F1(VDD1_F1) U2.F12(VDD1_F12) U2.G4(VDD1_G4) U2.G9(VDD1_G9) U2.T4(VDD1_T4) U2.T9(VDD1_T9) U2.U1(VDD1_U1) U2.U12(VDD1_U12)
DRAM_nRESET: R4.2 U1.R1(RESET_n_/_RESET_n_/_RESET#) U2.T11(RESET_N)
DRAM_VREF: U1.P1(VREF_/_VREF_/_VREF)
DRAM_ZQ0: R5.2 U2.A5(ZQ0)
DRAM_ZQ1: R6.2 U2.A8(NC_A8)
DRAMA_CA0: U1.J6(DRAM_AC08/CA0_A_/_A12_/_A12(BC#)) U2.R2(CA0_B)
DRAMA_CA1: U1.K6(DRAM_AC09/CA1_A_/_A11_/_A11) U2.P2(CA1_B)
DRAMA_CA2: U1.E4(DRAM_AC10/CA2_A_/_A7_/_A7) U2.R9(CA2_B)
DRAMA_CA3: U1.D5(DRAM_AC11/CA3_A_/_A8_/_A8) U2.R10(CA3_B)
DRAMA_CA4: U1.N4(DRAM_AC12/CA4_A_/_A6_/_A6) U2.R11(CA4_B)
DRAMA_CA5: U1.N5(DRAM_AC13/CA5_A_/_A5_/_A5) U2.P11(CA5_B)
DRAMA_CK_C: R8.2 U1.L1(DRAM_AC05/CK_c_A_/_BG1_/_A14) U2.P9(CK_c_B)
DRAMA_CK_T: R8.1 U1.L2(DRAM_AC04/CK_t_A_/_BG0_/_BA2) U2.P8(CK_t_B)
DRAMA_CKE0: R121.2 U1.F4(DRAM_AC00/CKE0_A_/_CKE0_/_CKE0) U2.P4(CKE0_B)
DRAMA_CKE1: R122.2 U1.F5(DRAM_AC01/CKE1_A_/_CKE1_/_CKE1) U2.P5(NC_P5)
DRAMA_DATA0: U1.A5(DRAM_DQ00) U2.AA11(DQ8_B)
DRAMA_DATA1: U1.B5(DRAM_DQ01) U2.Y11(DQ9_B)
DRAMA_DATA2: U1.D2(DRAM_DQ02) U2.V11(DQ10_B)
DRAMA_DATA3: U1.D1(DRAM_DQ03) U2.U11(DQ11_B)
DRAMA_DATA4: U1.C1(DRAM_DQ04) U2.U9(DQ12_B)
DRAMA_DATA5: U1.B1(DRAM_DQ05) U2.V9(DQ13_B)
DRAMA_DATA6: U1.A3(DRAM_DQ06) U2.Y9(DQ14_B)
DRAMA_DATA7: U1.B4(DRAM_DQ07) U2.AA9(DQ15_B)
DRAMA_DATA8: U1.F2(DRAM_DQ08) U2.AA2(DQ0_B)
DRAMA_DATA9: U1.G2(DRAM_DQ09) U2.Y2(DQ1_B)
DRAMA_DATA10: U1.J1(DRAM_DQ10) U2.V4(DQ5_B)
DRAMA_DATA11: U1.J2(DRAM_DQ11) U2.V2(DQ2_B)
DRAMA_DATA12: U1.K2(DRAM_DQ12) U2.U2(DQ3_B)
DRAMA_DATA13: U1.K1(DRAM_DQ13) U2.U4(DQ4_B)
DRAMA_DATA14: U1.E1(DRAM_DQ14) U2.AA4(DQ7_B)
DRAMA_DATA15: U1.E2(DRAM_DQ15) U2.Y4(DQ6_B)
DRAMA_DMI0: U1.A4(DRAM_DM0) U2.Y10(DMI1_B)
DRAMA_DMI1: U1.F1(DRAM_DM1) U2.Y3(DMI0_B)
DRAMA_nCS0: U1.K4(DRAM_AC02/CS0_A_/_CS0_n_/_CS0#) U2.R4(CS0_B)
DRAMA_nCS1: U1.J4(DRAM_AC03/CS1_A_/_C0_/_--) U2.R3(NC_R3)
DRAMA_SDQS0_C: U1.B2(DRAM_DQS0_N) U2.V10(DQS1_c_B)
DRAMA_SDQS0_T: U1.A2(DRAM_DQS0_P) U2.W10(DQS1_t_B)
DRAMA_SDQS1_C: U1.H1(DRAM_DQS1_N) U2.V3(DQS0_c_B)
DRAMA_SDQS1_T: U1.G1(DRAM_DQS1_P) U2.W3(DQS0_t_B)
DRAMB_CA0: U1.W6(DRAM_AC28/CA0_B_/_A13_/_A13) U2.H2(CA0_A)
DRAMB_CA1: U1.V6(DRAM_AC29/CA1_B_/_BA0_/_BA0) U2.J2(CA1_A)
DRAMB_CA2: U1.AC4(DRAM_AC30/CA2_B_/_A10(AP)_/_A10(AP)) U2.H9(CA2_A)
DRAMB_CA3: U1.AD5(DRAM_AC31/CA3_B_/_A0_/_A0) U2.H10(CA3_A)
DRAMB_CA4: U1.R4(DRAM_AC32/CA4_B_/_C2_/_--) U2.H11(CA4_A)
DRAMB_CA5: U1.R5(DRAM_AC33/CA5_B/CAS_n(A15)/CAS#) U2.J11(CA5_A)
DRAMB_CK_C: R9.2 U1.U1(DRAM_AC25/CK_c_B_/_A1_/_A1) U2.J9(CK_c_A)
DRAMB_CK_T: R9.1 U1.U2(DRAM_AC24/CK_t_B_/_A2_/_A2) U2.J8(CK_t_A)
DRAMB_CKE0: R123.2 U1.AB4(DRAM_AC20/CKE0_B_/_CK_t_B_/_CK_B) U2.J4(CKE0_A)
DRAMB_CKE1: R124.2 U1.AB5(DRAM_AC21/CKE1_B_/_CK_c_B_/_CK#_B) U2.J5(NC_J5)
DRAMB_DATA0: U1.AB2(DRAM_DQ16) U2.B2(DQ0_A)
DRAMB_DATA1: U1.AA2(DRAM_DQ17) U2.C2(DQ1_A)
DRAMB_DATA2: U1.W1(DRAM_DQ18) U2.F2(DQ3_A)
DRAMB_DATA3: U1.W2(DRAM_DQ19) U2.E2(DQ2_A)
DRAMB_DATA4: U1.V2(DRAM_DQ20) U2.E4(DQ5_A)
DRAMB_DATA5: U1.V1(DRAM_DQ21) U2.F4(DQ4_A)
DRAMB_DATA6: U1.AC1(DRAM_DQ22) U2.B4(DQ7_A)
DRAMB_DATA7: U1.AC2(DRAM_DQ23) U2.C4(DQ6_A)
DRAMB_DATA8: U1.AG5(DRAM_DQ24) U2.B11(DQ8_A)
DRAMB_DATA9: U1.AF5(DRAM_DQ25) U2.C11(DQ9_A)
DRAMB_DATA10: U1.AD2(DRAM_DQ26) U2.E11(DQ10_A)
DRAMB_DATA11: U1.AD1(DRAM_DQ27) U2.F11(DQ11_A)
DRAMB_DATA12: U1.AE1(DRAM_DQ28) U2.F9(DQ12_A)
DRAMB_DATA13: U1.AF1(DRAM_DQ29) U2.E9(DQ13_A)
DRAMB_DATA14: U1.AG3(DRAM_DQ30) U2.C9(DQ14_A)
DRAMB_DATA15: U1.AF4(DRAM_DQ31) U2.B9(DQ15_A)
DRAMB_DMI0: U1.AB1(DRAM_DM2) U2.C3(DMI0_A)
DRAMB_DMI1: U1.AG4(DRAM_DM3) U2.C10(DMI1_A)
DRAMB_nCS0: U1.V4(DRAM_AC23/CS0_B_/_--_/_--) U2.H4(CS0_A)
DRAMB_nCS1: U1.W4(DRAM_AC22/CS1_B_/_--_/_--) U2.H3(NC_H3)
DRAMB_SDQS0_C: U1.Y1(DRAM_DQS2_N) U2.E3(DQS0_c_A)
DRAMB_SDQS0_T: U1.AA1(DRAM_DQS2_P) U2.D3(DQS0_t_A)
DRAMB_SDQS1_C: U1.AF2(DRAM_DQS3_N) U2.E10(DQS1_c_A)
DRAMB_SDQS1_T: U1.AG2(DRAM_DQS3_P) U2.D10(DQS1_t_A)
NetR7_2: R7.2 U1.P2(DRAM_ZN)

Not connected (* = marked no-connect by the designer): U1 AB6(DRAM_AC38/--_/_CS1_n_/_CS1#)* F6(DRAM_AC06/--_/_ACT_n_/_A15)* J5(DRAM_AC07/--_/_A9_/_A9)* K5(DRAM_AC14/_--_/_A4_/_A4)* M1(DRAM_AC16/--_/_CK_t_A_/_CK_A)* M2(DRAM_AC17/--_/_CK_c_A_/_CK#_A)* N1(DRAM_AC26/--_/_BA1_/_BA1)* N2(DRAM_AC19/MTEST_/_MTEST_/_MTEST)* N6(DRAM_AC15/--_/_A3_/_A3)* R2(DRAM_ALERT_N)* R6(DRAM_AC27/--_/_PARITY_/_--)* T1(DRAM_AC34/_--_/WE_n(A14)/WE#)* T2(DRAM_AC35/--_/_RAS_n(A16)_/_RAS#)* V5(DRAM_AC36/--_/_ODT0_/_ODT0)* W5(DRAM_AC37/--_/_ODT1_/_ODT1)*; U2 A1(DNU_A1)* A2(DNU_A2)* A11(DNU_A11)* A12(DNU_A12)* AA1(DNU_AA1)* AA12(DNU_AA12)* AB1(DNU_AB1)* AB2(DNU_AB2)* AB11(DNU_AB11)* AB12(DNU_AB12)* B1(DNU_B1)* B12(DNU_B12)* G11(NC_G11)* K5(NC_K5)* K8(NC_K8)* N5(NC_N5)* N8(NC_N8)*

### Layout directives
differential pair; rule Matched Net Lengths [Delay Tolerance = 1ps]; differential pair class DDR_CK_DQS; differential pair class DRAMB_DQS: DRAMB_SDQS0_C, DRAMB_SDQS0_T, DRAMB_SDQS1_C, DRAMB_SDQS1_T
net class DRAM_BYTE0; rule Matched Net Lengths [Delay Tolerance = 10ps]: DRAMB_DATA0, DRAMB_DATA1, DRAMB_DATA2, DRAMB_DATA3, DRAMB_DATA4, DRAMB_DATA5, DRAMB_DATA6, DRAMB_DATA7, DRAMB_DMI0, DRAMB_SDQS0_C, DRAMB_SDQS0_T
net class DRAM_BYTE1; rule Matched Net Lengths [Delay Tolerance = 10ps]: DRAMB_DATA8, DRAMB_DATA9, DRAMB_DATA10, DRAMB_DATA11, DRAMB_DATA12, DRAMB_DATA13, DRAMB_DATA14, DRAMB_DATA15, DRAMB_DMI1, DRAMB_SDQS1_C, DRAMB_SDQS1_T
net class DRAM_BYTE2; rule Matched Net Lengths [Delay Tolerance = 10ps]: DRAMA_DATA8, DRAMA_DATA9, DRAMA_DATA10, DRAMA_DATA11, DRAMA_DATA12, DRAMA_DATA13, DRAMA_DATA14, DRAMA_DATA15, DRAMA_DMI1, DRAMA_SDQS1_C, DRAMA_SDQS1_T
net class DRAM_BYTE3; rule Matched Net Lengths [Delay Tolerance = 10ps]: DRAMA_DATA0, DRAMA_DATA1, DRAMA_DATA2, DRAMA_DATA3, DRAMA_DATA4, DRAMA_DATA5, DRAMA_DATA6, DRAMA_DATA7, DRAMA_DMI0, DRAMA_SDQS0_C, DRAMA_SDQS0_T
differential pair; rule Matched Net Lengths [Delay Tolerance = 1ps]; differential pair class DDR_CK_DQS; differential pair class DRAMA_DQS: DRAMA_SDQS0_C, DRAMA_SDQS0_T, DRAMA_SDQS1_C, DRAMA_SDQS1_T
differential pair; differential pair class DDR_CK_DQS; rule Length Constraint [Min Delay = 0ps    Max Delay = 200ps]; rule Matched Net Lengths [Delay Tolerance = 1ps]: DRAMA_CK_C, DRAMA_CK_T, DRAMB_CK_C, DRAMB_CK_T
net class DRAMB_CA; rule Matched Net Lengths [Delay Tolerance = 25ps]: DRAMB_CA0, DRAMB_CA1, DRAMB_CA2, DRAMB_CA3, DRAMB_CA4, DRAMB_CA5, DRAMB_CK_C, DRAMB_CK_T, DRAMB_CKE0, DRAMB_CKE1, DRAMB_nCS0, DRAMB_nCS1
net class DRAMA_CA; rule Matched Net Lengths [Delay Tolerance = 25ps]: DRAMA_CA0, DRAMA_CA1, DRAMA_CA2, DRAMA_CA3, DRAMA_CA4, DRAMA_CA5, DRAMA_CK_C, DRAMA_CK_T, DRAMA_CKE0, DRAMA_CKE1, DRAMA_nCS0, DRAMA_nCS1

### Notes on the sheet
- LPDDR4 SDRAM (2GB)
- ODT_CA_B
- (near U2) 1.06-1.17V
- ODT_CA_A
- Data Bus
- Command/Address
- Power Supply Voltage Ramp
- Pin Name
- LPDDR4
- DDR4
- RESET_n is held LOW.
  VDD1 >= VDD2
  VDD2 >= VDDQ
- DRAM_DQS0_P
  DRAM_DQS0_N
  DRAM_DM0
  DRAM_DQ00
  DRAM_DQ01
  DRAM_DQ02
  DRAM_DQ03
  DRAM_DQ04
  DRAM_DQ05
  DRAM_DQ06
  DRAM_DQ07
  DRAM_DQS1_P
  DRAM_DQS1_N
  DRAM_DM1
  DRAM_DQ08
  DRAM_DQ09
  DRAM_DQ10
  DRAM_DQ11
  DRAM_DQ12
  DRAM_DQ13
  DRAM_DQ14
  DRAM_DQ15
  DRAM_DQS2_P
  DRAM_DQS2_N
  DRAM_DM2
  DRAM_DQ16
  DRAM_DQ17
  DRAM_DQ18
  DRAM_DQ19
  DRAM_DQ20
  DRAM_DQ21
  DRAM_DQ22
  DRAM_DQ23
  DRAM_DQS3_P
  DRAM_DQS3_N
  DRAM_DM3
  DRAM_DQ24
  DRAM_DQ25
  DRAM_DQ26
  DRAM_DQ27
  DRAM_DQ28
  DRAM_DQ29
  DRAM_DQ30
  DRAM_DQ31
- DQS0_t_A
  DQS0_c_A
  DMI0_A
  DQ0_A
  DQ1_A
  DQ2_A
  DQ3_A
  DQ4_A
  DQ5_A
  DQ6_A
  DQ7_A
  DQS1_t_A
  DQS1_c_A
  DMI1_A
  DQ08_A
  DQ09_A
  DQ10_A
  DQ11_A
  DQ12_A
  DQ13_A
  DQ14_A
  DQ15_A
  DQS0_t_B
  DQS0_c_B
  DMI0_B
  DQ0_B
  DQ1_B
  DQ2_B
  DQ3_B
  DQ4_B
  DQ5_B
  DQ6_B
  DQ7_B
  DQS1_t_B
  DQS1_c_B
  DMI1_B
  DQ08_B
  DQ09_B
  DQ10_B
  DQ11_B
  DQ12_B
  DQ13_B
  DQ14_B
  DQ15_B
- DQSL_t_A
  DQSL_c_A
  DML_n_A / DBIL_n_A
  DQL0_A
  DQL1_A
  DQL2_A
  DQL3_A
  DQL4_A
  DQL5_A
  DQL6_A
  DQL7_A
  DQSU_t_A
  DQSU_c_A
  DMU_n_A / DBIU_n_A
  DQU0_A
  DQU1_A
  DQU2_A
  DQU3_A
  DQU4_A
  DQU5_A
  DQU6_A
  DQU7_A
  DQSL_t_B
  DQSL_c_B
  DML_n_B / DBIL_n_B
  DQL0_B
  DQL1_B
  DQL2_B
  DQL3_B
  DQL4_B
  DQL5_B
  DQL6_B
  DQL7_B
  DQSU_t_B
  DQSU_c_B
  DMU_n_B / DBIU_n_B
  DQU0_B
  DQU1_B
  DQU2_B
  DQU3_B
  DQU4_B
  DQU5_B
  DQU6_B
  DQU7_B
- DRAM_RESET_N
  DRAM_ALERT_N
  DRAM_AC00
  DRAM_AC01
  DRAM_AC02
  DRAM_AC03
  DRAM_AC04
  DRAM_AC05
  DRAM_AC06
  DRAM_AC07
  DRAM_AC08
  DRAM_AC09
  DRAM_AC10
  DRAM_AC11
  DRAM_AC12
  DRAM_AC13
  DRAM_AC14
  DRAM_AC15
  DRAM_AC16
  DRAM_AC17
  DRAM_AC19
  DRAM_AC20
  DRAM_AC21
  DRAM_AC22
  DRAM_AC23
  DRAM_AC24
  DRAM_AC25
  DRAM_AC26
  DRAM_AC27
  DRAM_AC28
  DRAM_AC29
  DRAM_AC30
  DRAM_AC31
  DRAM_AC32
  DRAM_AC33
  DRAM_AC34
  DRAM_AC35
  DRAM_AC36
  DRAM_AC37
  DRAM_AC38
  DRAM_ZN
  DRAM_VREF
- RESET_N
  MTEST1
  CKE0_A
  CKE1_A
  CS0_A
  CS1_A
  CK_t_A
  CK_c_A
  /
  /
  CA0_A
  CA1_A
  CA2_A
  CA3_A
  CA4_A
  CA5_A
  /
  /
  /
  MTEST
  CKE0_B
  CKE1_B
  CS1_B
  CS0_B
  CK_t_B
  CK_c_B
  /
  /
  CA0_B
  CA1_B
  CA2_B
  CA3_B
  CA4_B
  CA5_B
  /
  /
  /
  /
  ZQ
  VREF
- RESET_n
  ALERT_n / MTEST1
  CKE0
  CKE1
  CS0_n
  C0
  BG0
  BG1
  ACT_n
  A9
  A12
  A11
  A7
  A8
  A6
  A5
  A4
  A3
  CK_t_A
  CK_c_A
  MTEST
  CK_t_B
  CK_c_B
  /
  /
  A2
  A1
  BA1
  PARITY
  A13
  BA0
  A10 / AP
  A0
  C2
  CAS_n / A15
  WE_n / A14
  RAS_n / A16
  ODT0
  ODT1
  CS1_n
  ZQ
  VREF
- DWG. NO.
- REV.
- SHT.
- REVISION
- DESCRIPTION
- DATE
- APPROVED
- ENG:
- DSN:
- APPROVALS
- PROJECT
- REFERENCE DOCUMENTS
- BOM:
- CHK:
- TITLE
- ASSY DWG:
- FAB DWG:
- PCB DWG:
- SIZE
- FILE NAME
- C
- SCHEMATIC DOCUMENT NUMBER
- SHEET
- OF
- REV
- (in symbol MIMX8MM_BGA486P, part A) i.MX8M Mini - DDR; PAD/(LPDDR4/DDR4/DDR3)

### Library data of the parts
C105 C106 C108 C117 = CAP_NP: CAP CER 10UF 6.3V 20% X5R 0402; MFG_PN01: CL05A106MQ5NUNC; MFG_NAME01: SAMSUNG ELECTRO MECHANICS; EIA Case: 0402; Temp Range: -55°C ~ 125°C; Value: 10uF; ROHS: Yes; Tolerance: 20%; PCB Footprint: 0402_cc_nsp
C109-C113 C115 C118 C119 = CAP_NP: CAP CER 10UF 6.3V 20% X5R 0402; MFG_NAME01: SAMSUNG ELECTRO MECHANICS; MFG_PN01: CL05A106MQ5NUNC; EIA Case: 0402; Temp Range: -55°C ~ 125°C; Value: 10uF; Tolerance: 20%; ROHS: Yes; PCB Footprint: 0402_cc_nsp
C114 C371 C374 C376 C379 C381 C382 C384 = CAP_NP: as C1 on sheet 02-CPUPWR QCMI SOM; Value: 0.22uF; PCB Footprint: 0201_CC; ROHS: Yes; Tolerance: 20%
C370 C372 C373 C375 C378 C380 = CAP_NP: as C5 on sheet 02-CPUPWR QCMI SOM; Value: 0.22uF; PCB Footprint: 0201_CC; Tolerance: 20%; ROHS: Yes
R4 R121 R123 = RES: RES MF 10K 1/20W 5% 0201; MFG_PN01: RTT01103JTH; MFG_NAME01: RALEC ELECTRONIC CORP; EIA Case: 0201; Temp Range: -55°C ~ 125°C; Value: 10K; PCB Footprint: 0201_CC; ROHS: Yes; Tolerance: 5%; Rated Power: 1/20W
R5 = RES: RES MF 240 OHM 1/20W 1% 0201; MFG_NAME01: YAGEO AMERICA; MFG_PN01: RC0201FR-07240RL; EIA Case: 0201; VOLTAGE: 25V; Temp Range: -55°C ~ 125°C; Value: 240 OHM; PCB Footprint: 0201_CC; ROHS: Yes; Rated Power: 1/20W
R6 = RES: RES MF 240 OHM 1/20W 1% 0201; MFG_NAME01: YAGEO AMERICA; MFG_PN01: RC0201FR-07240RL; EIA Case: 0201; VOLTAGE: 25V; Temp Range: -55°C ~ 155°C; Value: 240 OHM; PCB Footprint: 0201_CC; ROHS: Yes; Rated Power: 1/20W
R7 = RES: RES MF 240 OHM 1/20W 1% 0201; MFG_PN01: RC0201FR-07240RL; MFG_NAME01: YAGEO AMERICA; EIA Case: 0201; VOLTAGE: 25V; Temp Range: -55°C ~ 155°C; Value: 240 OHM; PCB Footprint: 0201_CC; ROHS: Yes; Rated Power: 1/20W
R8 R9 = RES: RES MF 150 OHM 1/16W 1% 0402; MFG_NAME01: NIC COMPONENTS CORP; MFG_PN01: NRCL04F1500TRF; EIA Case: 0402; Value: 150; ROHS: Yes; PCB Footprint: 0402_CC; Rated Power: 1/16W
R122 R124 = RES: RES MF 10K 1/20W 5% 0201; MFG_NAME01: RALEC ELECTRONIC CORP; MFG_PN01: RTT01103JTH; EIA Case: 0201; Temp Range: -55°C ~ 125°C; Value: 10K; PCB Footprint: 0201_CC; Tolerance: 5%; ROHS: Yes; Rated Power: 1/20W
U1 = MIMX8MM_BGA486P: as U1 on sheet 02-CPUPWR QCMI SOM; Value: MIMX8MM6DVTLZAA; MFG_PN01: MIMX8MM6DVTLZAA; ROHS: Yes; PCB Footprint: bga486_0p5_14x14; JEDEC Case: BGA486
U2 = MT53D512M32D2DS_BGA200P: IC MEM MOBILE LPDDR4 DUAL-CH SINGLE RANK DISCRETE 512MbX32 1.1V  WFBGA200; Temp Range: -25°C ~ 85°C; MFG_NAME01: MICRON; JEDEC Case: BGA200; Value: MT53E512M32D2NP-046 WT:F; PCB Footprint: bga200_0p65x0p8_10p1x14p6; ROHS: Yes; MFG_PN01: MT53E512M32D2NP-046 WT:F

## Sheet 04-CPUIO QCMI SOM.SchDoc: CPU IO
size 558 x 431 mm; CAGE_CODE: 8LSW1; Designer: B. Jordan; DsnPath: G:\My Drive\Quilter Computer - Engineering Assets\NXP i.MX8M-Mini\8MMINILPD4-CPU2-DESIGNFILES\8MMINILPD4-CPU2-DESIGNFILES\SCH-47712_A4.DSN; ApprovedBy: S. Nesterenko; CheckedBy: D. Gudino; Author: B. Jordan; CompanyName: Allegro Labs, Inc.; DrawnBy: B. Jordan; Engineer: B. Jordan; Address1: 29315 Stonecrest Rd; Address2: Rolling Hills Estates; Address3: CA, 90275; Address4: USA; DocumentNumber: QCMISM-SCH-04-0; Revision: 0; SheetNumber: 04; SheetTotal: 10; CHK_APP_DATE: --/--/--; DSN_APP_DATE: --/--/--; ENG_APP_DATE: --/--/--; DOC_NO_BOM: TBD; DOC_NO_ASSY_DWG: TBD; DOC_NO_FAB_DWG: TBD; DOC_NO_PCB_DWG: TBD
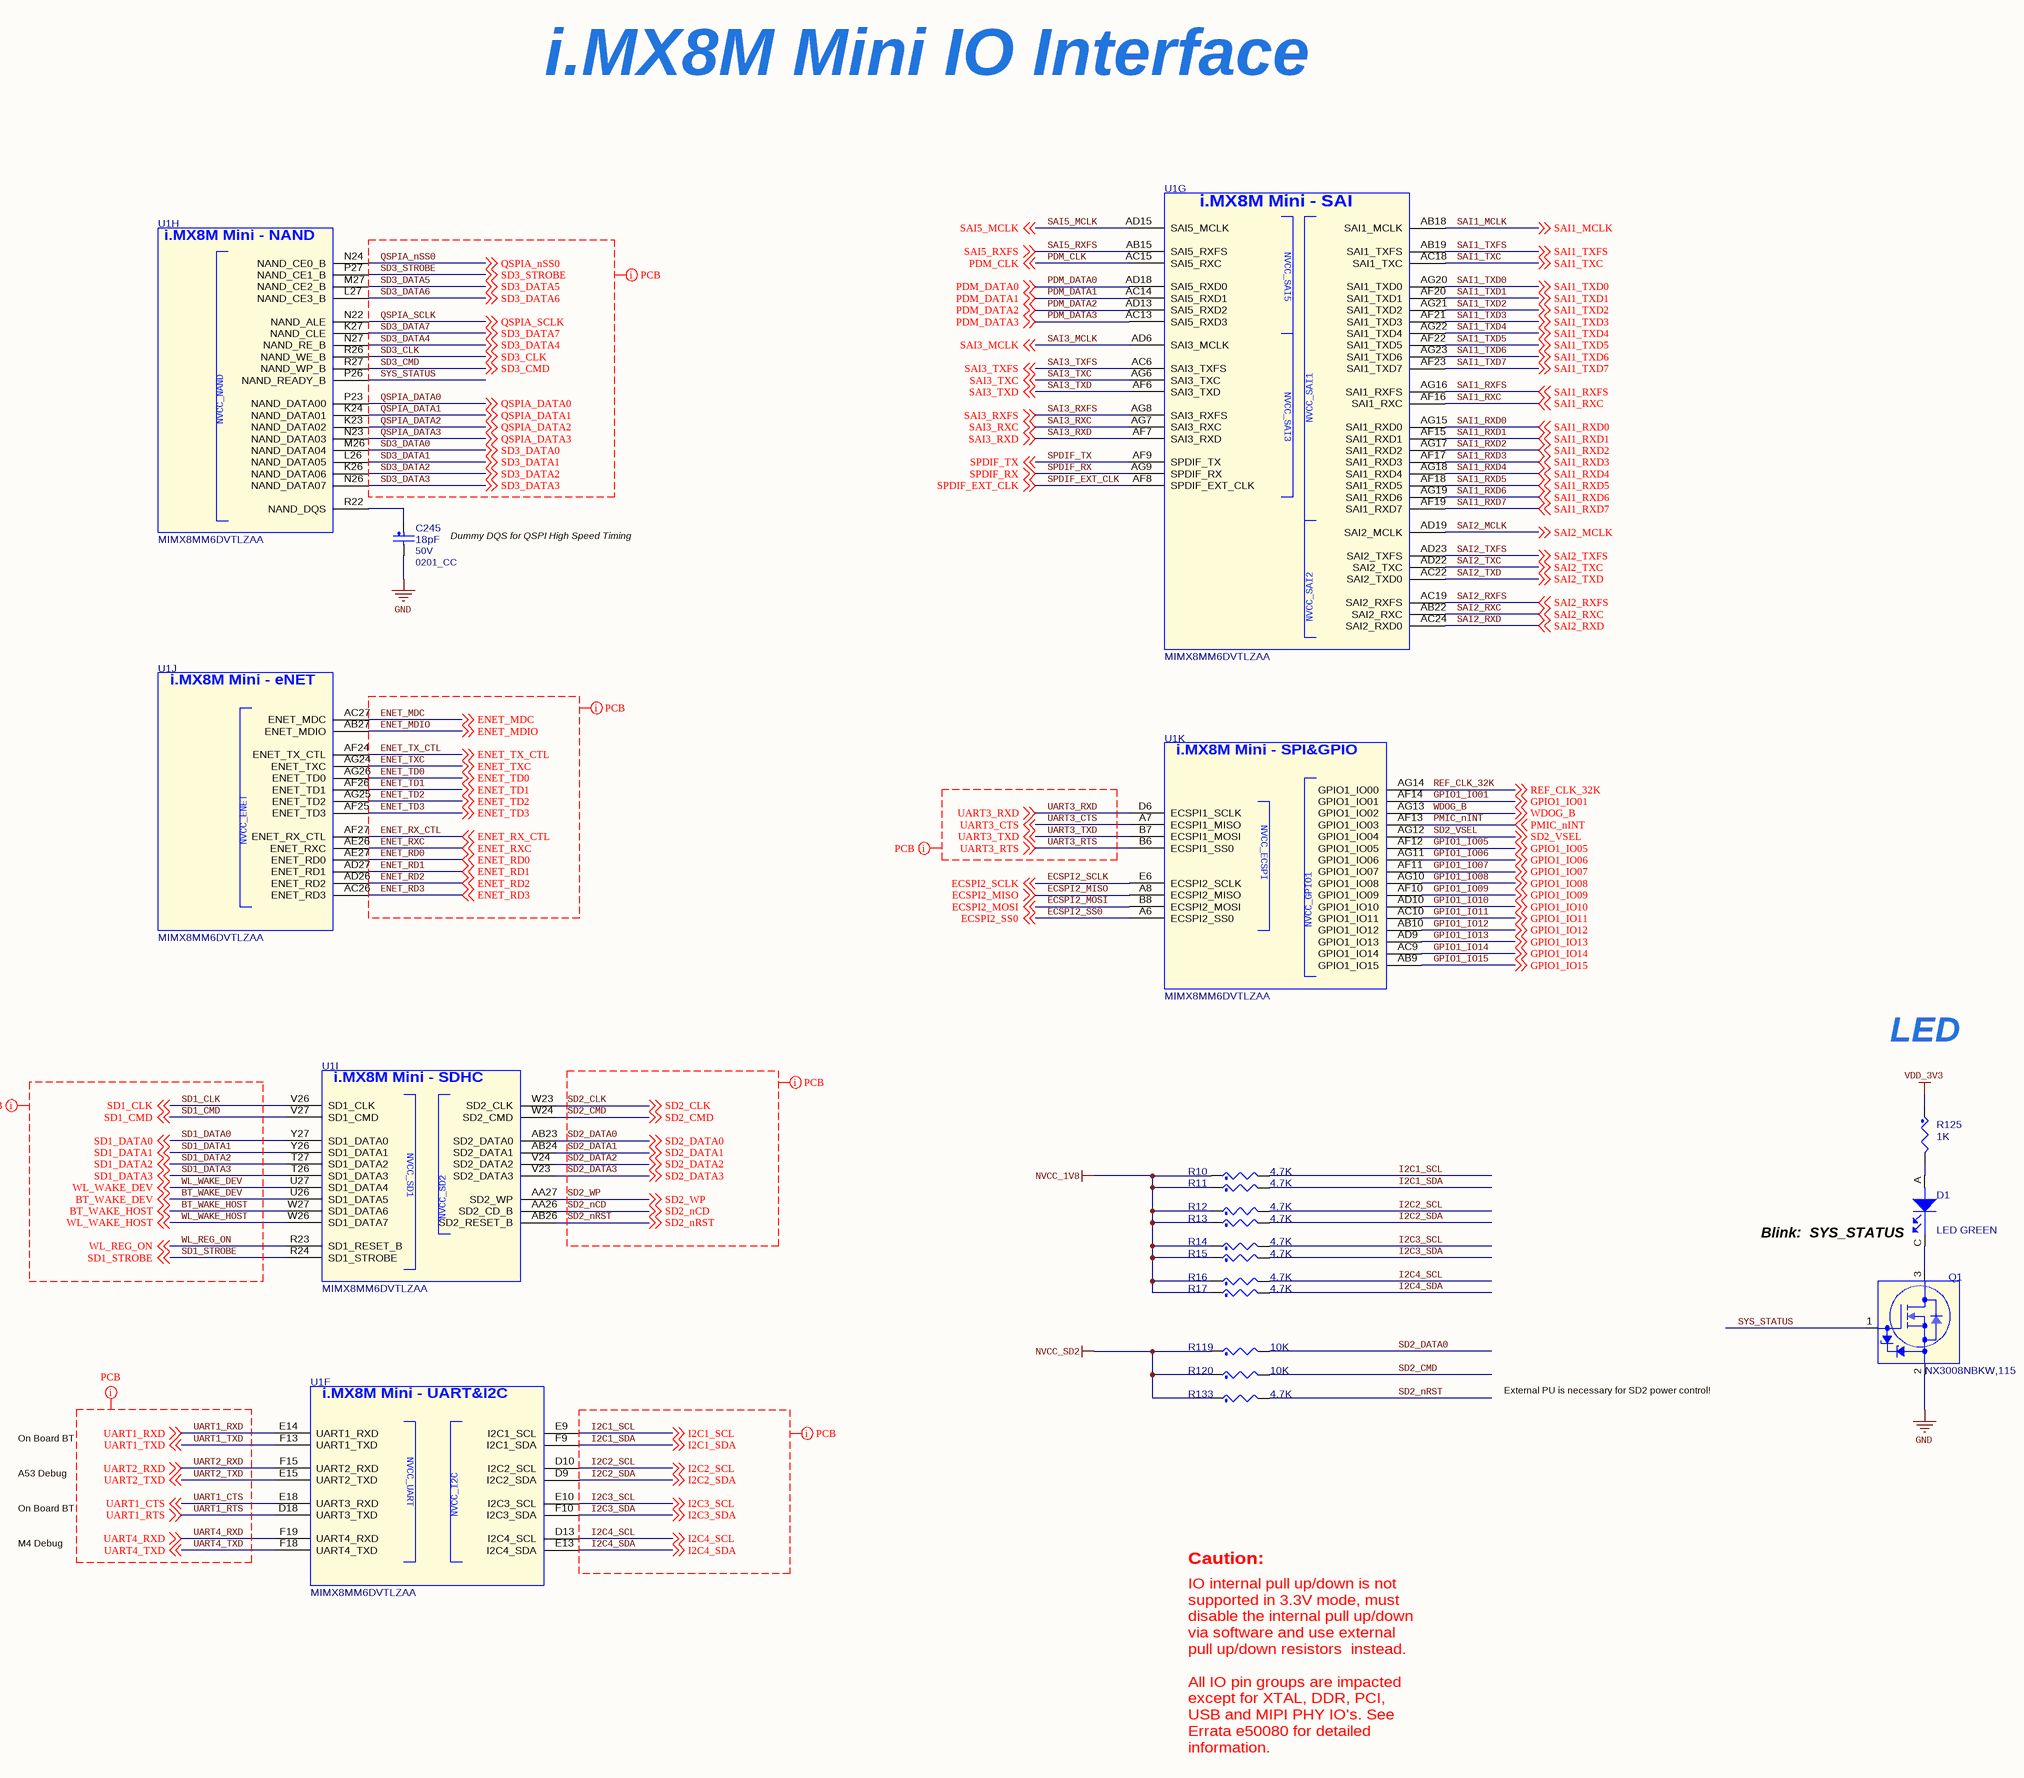
[diagram p3: 04-CPUIO QCMI SOM.SchDoc]

### Parts
C245  18pF  VOLTAGE: 50V  [0201_CC]
D1  LED GREEN  [LED_0603]
Q1  NX3008NBKW,115  [sc70_3]
R10  4.7K  [0201_CC]
R11  4.7K  [0201_CC]
R12  4.7K  [0201_CC]
R13  4.7K  [0201_CC]
R14  4.7K  [0201_CC]
R15  4.7K  [0201_CC]
R16  4.7K  [0201_CC]
R17  4.7K  [0201_CC]
R119  10K  [0201_CC]
R120  10K  [0201_CC]
R125  1K  [0201_CC]
R133  4.7K  [0201_CC]
U1  MIMX8MM6DVTLZAA  [bga486_0p5_14x14]  (parts F,G,H,I,J,K of 14)

### Nets
GND: C245.2 Q1.2(SOURCE)
NVCC_1V8: R10.1 R11.1 R12.1 R13.1 R14.1 R15.1 R16.1 R17.1  [project net VDD_1V8]
NVCC_SD2: R119.1 R120.1 R133.1
VDD_3V3: R125.1
BT_WAKE_DEV: U1.U26(SD1_DATA5) ; off-sheet BT_WAKE_DEV
BT_WAKE_HOST: U1.W27(SD1_DATA6) ; off-sheet BT_WAKE_HOST
ECSPI2_MISO: U1.A8(ECSPI2_MISO) ; off-sheet ECSPI2_MISO
ECSPI2_MOSI: U1.B8(ECSPI2_MOSI) ; off-sheet ECSPI2_MOSI
ECSPI2_SCLK: U1.E6(ECSPI2_SCLK) ; off-sheet ECSPI2_SCLK
ECSPI2_SS0: U1.A6(ECSPI2_SS0) ; off-sheet ECSPI2_SS0
ENET_MDC: U1.AC27(ENET_MDC) ; off-sheet ENET_MDC
ENET_MDIO: U1.AB27(ENET_MDIO) ; off-sheet ENET_MDIO
ENET_RD0: U1.AE27(ENET_RD0) ; off-sheet ENET_RD0
ENET_RD1: U1.AD27(ENET_RD1) ; off-sheet ENET_RD1
ENET_RD2: U1.AD26(ENET_RD2) ; off-sheet ENET_RD2
ENET_RD3: U1.AC26(ENET_RD3) ; off-sheet ENET_RD3
ENET_RX_CTL: U1.AF27(ENET_RX_CTL) ; off-sheet ENET_RX_CTL
ENET_RXC: U1.AE26(ENET_RXC) ; off-sheet ENET_RXC
ENET_TD0: U1.AG26(ENET_TD0) ; off-sheet ENET_TD0
ENET_TD1: U1.AF26(ENET_TD1) ; off-sheet ENET_TD1
ENET_TD2: U1.AG25(ENET_TD2) ; off-sheet ENET_TD2
ENET_TD3: U1.AF25(ENET_TD3) ; off-sheet ENET_TD3
ENET_TX_CTL: U1.AF24(ENET_TX_CTL) ; off-sheet ENET_TX_CTL
ENET_TXC: U1.AG24(ENET_TXC) ; off-sheet ENET_TXC
GPIO1_IO01: U1.AF14(GPIO1_IO01) ; off-sheet GPIO1_IO01
GPIO1_IO05: U1.AF12(GPIO1_IO05) ; off-sheet GPIO1_IO05
GPIO1_IO06: U1.AG11(GPIO1_IO06) ; off-sheet GPIO1_IO06
GPIO1_IO07: U1.AF11(GPIO1_IO07) ; off-sheet GPIO1_IO07
GPIO1_IO08: U1.AG10(GPIO1_IO08) ; off-sheet GPIO1_IO08
GPIO1_IO09: U1.AF10(GPIO1_IO09) ; off-sheet GPIO1_IO09
GPIO1_IO10: U1.AD10(GPIO1_IO10) ; off-sheet GPIO1_IO10
GPIO1_IO11: U1.AC10(GPIO1_IO11) ; off-sheet GPIO1_IO11
GPIO1_IO12: U1.AB10(GPIO1_IO12) ; off-sheet GPIO1_IO12
GPIO1_IO13: U1.AD9(GPIO1_IO13) ; off-sheet GPIO1_IO13
GPIO1_IO14: U1.AC9(GPIO1_IO14) ; off-sheet GPIO1_IO14
GPIO1_IO15: U1.AB9(GPIO1_IO15) ; off-sheet GPIO1_IO15
I2C1_SCL: R10.2 U1.E9(I2C1_SCL) ; off-sheet I2C1_SCL
I2C1_SDA: R11.2 U1.F9(I2C1_SDA) ; off-sheet I2C1_SDA
I2C2_SCL: R12.2 U1.D10(I2C2_SCL) ; off-sheet I2C2_SCL
I2C2_SDA: R13.2 U1.D9(I2C2_SDA) ; off-sheet I2C2_SDA
I2C3_SCL: R14.2 U1.E10(I2C3_SCL) ; off-sheet I2C3_SCL
I2C3_SDA: R15.2 U1.F10(I2C3_SDA) ; off-sheet I2C3_SDA
I2C4_SCL: R16.2 U1.D13(I2C4_SCL) ; off-sheet I2C4_SCL
I2C4_SDA: R17.2 U1.E13(I2C4_SDA) ; off-sheet I2C4_SDA
PDM_CLK: U1.AC15(SAI5_RXC) ; off-sheet PDM_CLK
PDM_DATA0: U1.AD18(SAI5_RXD0) ; off-sheet PDM_DATA0
PDM_DATA1: U1.AC14(SAI5_RXD1) ; off-sheet PDM_DATA1
PDM_DATA2: U1.AD13(SAI5_RXD2) ; off-sheet PDM_DATA2
PDM_DATA3: U1.AC13(SAI5_RXD3) ; off-sheet PDM_DATA3
PMIC_nINT: U1.AF13(GPIO1_IO03) ; off-sheet PMIC_nINT
QSPIA_DATA0: U1.P23(NAND_DATA00) ; off-sheet QSPIA_DATA0
QSPIA_DATA1: U1.K24(NAND_DATA01) ; off-sheet QSPIA_DATA1
QSPIA_DATA2: U1.K23(NAND_DATA02) ; off-sheet QSPIA_DATA2
QSPIA_DATA3: U1.N23(NAND_DATA03) ; off-sheet QSPIA_DATA3
QSPIA_nSS0: U1.N24(NAND_CE0_B) ; off-sheet QSPIA_nSS0
QSPIA_SCLK: U1.N22(NAND_ALE) ; off-sheet QSPIA_SCLK
REF_CLK_32K: U1.AG14(GPIO1_IO00) ; off-sheet REF_CLK_32K
SAI1_MCLK: U1.AB18(SAI1_MCLK) ; off-sheet SAI1_MCLK
SAI1_RXC: U1.AF16(SAI1_RXC) ; off-sheet SAI1_RXC
SAI1_RXD0: U1.AG15(SAI1_RXD0) ; off-sheet SAI1_RXD0
SAI1_RXD1: U1.AF15(SAI1_RXD1) ; off-sheet SAI1_RXD1
SAI1_RXD2: U1.AG17(SAI1_RXD2) ; off-sheet SAI1_RXD2
SAI1_RXD3: U1.AF17(SAI1_RXD3) ; off-sheet SAI1_RXD3
SAI1_RXD4: U1.AG18(SAI1_RXD4) ; off-sheet SAI1_RXD4
SAI1_RXD5: U1.AF18(SAI1_RXD5) ; off-sheet SAI1_RXD5
SAI1_RXD6: U1.AG19(SAI1_RXD6) ; off-sheet SAI1_RXD6
SAI1_RXD7: U1.AF19(SAI1_RXD7) ; off-sheet SAI1_RXD7
SAI1_RXFS: U1.AG16(SAI1_RXFS) ; off-sheet SAI1_RXFS
SAI1_TXC: U1.AC18(SAI1_TXC) ; off-sheet SAI1_TXC
SAI1_TXD0: U1.AG20(SAI1_TXD0) ; off-sheet SAI1_TXD0
SAI1_TXD1: U1.AF20(SAI1_TXD1) ; off-sheet SAI1_TXD1
SAI1_TXD2: U1.AG21(SAI1_TXD2) ; off-sheet SAI1_TXD2
SAI1_TXD3: U1.AF21(SAI1_TXD3) ; off-sheet SAI1_TXD3
SAI1_TXD4: U1.AG22(SAI1_TXD4) ; off-sheet SAI1_TXD4
SAI1_TXD5: U1.AF22(SAI1_TXD5) ; off-sheet SAI1_TXD5
SAI1_TXD6: U1.AG23(SAI1_TXD6) ; off-sheet SAI1_TXD6
SAI1_TXD7: U1.AF23(SAI1_TXD7) ; off-sheet SAI1_TXD7
SAI1_TXFS: U1.AB19(SAI1_TXFS) ; off-sheet SAI1_TXFS
SAI2_MCLK: U1.AD19(SAI2_MCLK) ; off-sheet SAI2_MCLK
SAI2_RXC: U1.AB22(SAI2_RXC) ; off-sheet SAI2_RXC
SAI2_RXD: U1.AC24(SAI2_RXD0) ; off-sheet SAI2_RXD
SAI2_RXFS: U1.AC19(SAI2_RXFS) ; off-sheet SAI2_RXFS
SAI2_TXC: U1.AD22(SAI2_TXC) ; off-sheet SAI2_TXC
SAI2_TXD: U1.AC22(SAI2_TXD0) ; off-sheet SAI2_TXD
SAI2_TXFS: U1.AD23(SAI2_TXFS) ; off-sheet SAI2_TXFS
SAI3_MCLK: U1.AD6(SAI3_MCLK) ; off-sheet SAI3_MCLK
SAI3_RXC: U1.AG7(SAI3_RXC) ; off-sheet SAI3_RXC
SAI3_RXD: U1.AF7(SAI3_RXD) ; off-sheet SAI3_RXD
SAI3_RXFS: U1.AG8(SAI3_RXFS) ; off-sheet SAI3_RXFS
SAI3_TXC: U1.AG6(SAI3_TXC) ; off-sheet SAI3_TXC
SAI3_TXD: U1.AF6(SAI3_TXD) ; off-sheet SAI3_TXD
SAI3_TXFS: U1.AC6(SAI3_TXFS) ; off-sheet SAI3_TXFS
SAI5_MCLK: U1.AD15(SAI5_MCLK) ; off-sheet SAI5_MCLK
SAI5_RXFS: U1.AB15(SAI5_RXFS) ; off-sheet SAI5_RXFS
SD1_CLK: U1.V26(SD1_CLK) ; off-sheet SD1_CLK
SD1_CMD: U1.V27(SD1_CMD) ; off-sheet SD1_CMD
SD1_DATA0: U1.Y27(SD1_DATA0) ; off-sheet SD1_DATA0
SD1_DATA1: U1.Y26(SD1_DATA1) ; off-sheet SD1_DATA1
SD1_DATA2: U1.T27(SD1_DATA2) ; off-sheet SD1_DATA2
SD1_DATA3: U1.T26(SD1_DATA3) ; off-sheet SD1_DATA3
SD1_STROBE: U1.R24(SD1_STROBE) ; off-sheet SD1_STROBE
SD2_CLK: U1.W23(SD2_CLK) ; off-sheet SD2_CLK
SD2_CMD: R120.2 U1.W24(SD2_CMD) ; off-sheet SD2_CMD
SD2_DATA0: R119.2 U1.AB23(SD2_DATA0) ; off-sheet SD2_DATA0
SD2_DATA1: U1.AB24(SD2_DATA1) ; off-sheet SD2_DATA1
SD2_DATA2: U1.V24(SD2_DATA2) ; off-sheet SD2_DATA2
SD2_DATA3: U1.V23(SD2_DATA3) ; off-sheet SD2_DATA3
SD2_nCD: U1.AA26(SD2_CD_B) ; off-sheet SD2_nCD
SD2_nRST: R133.2 U1.AB26(SD2_RESET_B) ; off-sheet SD2_nRST
SD2_VSEL: U1.AG12(GPIO1_IO04) ; off-sheet SD2_VSEL
SD2_WP: U1.AA27(SD2_WP) ; off-sheet SD2_WP
SD3_CLK: U1.R26(NAND_WE_B) ; off-sheet SD3_CLK
SD3_CMD: U1.R27(NAND_WP_B) ; off-sheet SD3_CMD
SD3_DATA0: U1.M26(NAND_DATA04) ; off-sheet SD3_DATA0
SD3_DATA1: U1.L26(NAND_DATA05) ; off-sheet SD3_DATA1
SD3_DATA2: U1.K26(NAND_DATA06) ; off-sheet SD3_DATA2
SD3_DATA3: U1.N26(NAND_DATA07) ; off-sheet SD3_DATA3
SD3_DATA4: U1.N27(NAND_RE_B) ; off-sheet SD3_DATA4
SD3_DATA5: U1.M27(NAND_CE2_B) ; off-sheet SD3_DATA5
SD3_DATA6: U1.L27(NAND_CE3_B) ; off-sheet SD3_DATA6
SD3_DATA7: U1.K27(NAND_CLE) ; off-sheet SD3_DATA7
SD3_STROBE: U1.P27(NAND_CE1_B) ; off-sheet SD3_STROBE
SPDIF_EXT_CLK: U1.AF8(SPDIF_EXT_CLK) ; off-sheet SPDIF_EXT_CLK
SPDIF_RX: U1.AG9(SPDIF_RX) ; off-sheet SPDIF_RX
SPDIF_TX: U1.AF9(SPDIF_TX) ; off-sheet SPDIF_TX
SYS_STATUS: Q1.1(GATE) U1.P26(NAND_READY_B)
UART1_CTS: U1.E18(UART3_RXD) ; off-sheet UART1_CTS
UART1_RTS: U1.D18(UART3_TXD) ; off-sheet UART1_RTS
UART1_RXD: U1.E14(UART1_RXD) ; off-sheet UART1_RXD
UART1_TXD: U1.F13(UART1_TXD) ; off-sheet UART1_TXD
UART2_RXD: U1.F15(UART2_RXD) ; off-sheet UART2_RXD
UART2_TXD: U1.E15(UART2_TXD) ; off-sheet UART2_TXD
UART3_CTS: U1.A7(ECSPI1_MISO) ; off-sheet UART3_CTS
UART3_RTS: U1.B6(ECSPI1_SS0) ; off-sheet UART3_RTS
UART3_RXD: U1.D6(ECSPI1_SCLK) ; off-sheet UART3_RXD
UART3_TXD: U1.B7(ECSPI1_MOSI) ; off-sheet UART3_TXD
UART4_RXD: U1.F19(UART4_RXD) ; off-sheet UART4_RXD
UART4_TXD: U1.F18(UART4_TXD) ; off-sheet UART4_TXD
WDOG_B: U1.AG13(GPIO1_IO02) ; off-sheet WDOG_B
WL_REG_ON: U1.R23(SD1_RESET_B) ; off-sheet WL_REG_ON
WL_WAKE_DEV: U1.U27(SD1_DATA4) ; off-sheet WL_WAKE_DEV
WL_WAKE_HOST: U1.W26(SD1_DATA7) ; off-sheet WL_WAKE_HOST
NetC245_1: C245.1 U1.R22(NAND_DQS)
NetD1_A: D1.A(ANODE) R125.2
NetD1_C: D1.C(CATHODE) Q1.3(DRAIN)

### Layout directives
net class ETH: ENET_MDC, ENET_MDIO, ENET_RD0, ENET_RD1, ENET_RD2, ENET_RD3, ENET_RX_CTL, ENET_RXC, ENET_TD0, ENET_TD1, ENET_TD2, ENET_TD3, ENET_TX_CTL, ENET_TXC
net class SD2: SD2_CLK, SD2_CMD, SD2_DATA0, SD2_DATA1, SD2_DATA2, SD2_DATA3, SD2_nCD, SD2_nRST, SD2_WP
net class SD1: BT_WAKE_DEV, BT_WAKE_HOST, SD1_CLK, SD1_CMD, SD1_DATA0, SD1_DATA1, SD1_DATA2, SD1_DATA3, SD1_STROBE, WL_REG_ON, WL_WAKE_DEV, WL_WAKE_HOST
net class I2C: I2C1_SCL, I2C1_SDA, I2C2_SCL, I2C2_SDA, I2C3_SCL, I2C3_SDA, I2C4_SCL, I2C4_SDA
net class UART: UART1_CTS, UART1_RTS, UART1_RXD, UART1_TXD, UART2_RXD, UART2_TXD, UART3_CTS, UART3_RTS, UART3_RXD, UART3_TXD, UART4_RXD, UART4_TXD
net class NAND: QSPIA_DATA0, QSPIA_DATA1, QSPIA_DATA2, QSPIA_DATA3, QSPIA_nSS0, QSPIA_SCLK, SD3_CLK, SD3_CMD, SD3_DATA0, SD3_DATA1, SD3_DATA2, SD3_DATA3, SD3_DATA4, SD3_DATA5, SD3_DATA6, SD3_DATA7, SD3_STROBE, SYS_STATUS

### Notes on the sheet
- i.MX8M Mini IO Interface
- Dummy DQS for QSPI High Speed Timing
- LED
- (near D1) Blink:  SYS_STATUS
- On Board BT
- External PU is necessary for SD2 power control!
- A53 Debug
- M4 Debug
- Caution:
- IO internal pull up/down is not supported in 3.3V mode, must disable the internal pull up/down via software and use external pull up/down resistors  instead.
  All IO pin groups are impacted except for XTAL, DDR, PCI, USB and MIPI PHY IO's. See Errata e50080 for detailed information.
- DWG. NO.
- REV.
- SHT.
- REVISION
- DESCRIPTION
- DATE
- APPROVED
- ENG:
- DSN:
- APPROVALS
- PROJECT
- REFERENCE DOCUMENTS
- BOM:
- CHK:
- TITLE
- ASSY DWG:
- FAB DWG:
- PCB DWG:
- SIZE
- FILE NAME
- C
- SCHEMATIC DOCUMENT NUMBER
- SHEET
- OF
- REV
- (in symbol MIMX8MM_BGA486P, part F) i.MX8M Mini - UART&I2C
- (in symbol MIMX8MM_BGA486P, part G) i.MX8M Mini - SAI
- (in symbol MIMX8MM_BGA486P, part H) i.MX8M Mini - NAND
- (in symbol MIMX8MM_BGA486P, part I) i.MX8M Mini - SDHC
- (in symbol MIMX8MM_BGA486P, part J) i.MX8M Mini - eNET
- (in symbol MIMX8MM_BGA486P, part K) i.MX8M Mini - SPI&GPIO

### Library data of the parts
C245 = CAP_NP: CAP CER 18pF 50V 5% C0G 0201; Temp Range: -55°C ~ 125°C; EIA Case: 0201; MFG_NAME01: MURATA; MFG_PN01: GRM0335C1H180JA01D; Value: 18pF; Tolerance: 5%; ROHS: Yes; PCB Footprint: 0201_CC
D1 = LED: LED GRN SGL 25MA SMT 0603; VOLTAGE: 2V; EIA Case: 0603; MFG_NAME01: DIALIGHT; MFG_PN01: 598-8070-107F; Value: LED GREEN; ROHS: Yes; PCB Footprint: LED_0603
Q1 = NMOS_NX3008NBK: TRAN NMOS SW 30V 350mA AEC-Q101 SC-70; MFG_NAME01: NEXPERIA; EIA Case: SC70-3; Value: NX3008NBKW,115; MFG_PN01: NX3008NBKW,115; ROHS: Yes; PCB Footprint: sc70_3
R10 R11 R14-R17 = RES: RES MF 4.7K 1/20W 5% AEC-Q200 0201; Temp Range: -55°C ~ 155°C; EIA Case: 0201; MFG_PN01: RK73B1HTTC472J; MFG_NAME01: KOA SPEER; Value: 4.7K; ROHS: Yes; Tolerance: 5%; PCB Footprint: 0201_CC; Rated Power: 1/20W
R12 R13 R133 = RES: RES MF 4.7K 1/20W 5% AEC-Q200 0201; Temp Range: -55°C ~ 155°C; EIA Case: 0201; MFG_NAME01: KOA SPEER; MFG_PN01: RK73B1HTTC472J; Value: 4.7K; Tolerance: 5%; ROHS: Yes; PCB Footprint: 0201_CC; Rated Power: 1/20W
R119 = RES: RES MF 10K 1/20W 5% 0201; MFG_PN01: RTT01103JTH; MFG_NAME01: RALEC ELECTRONIC CORP; EIA Case: 0201; Value: 10K; ROHS: Yes; Tolerance: 5%; PCB Footprint: 0201_CC; Rated Power: 1/20W
R120 = RES: RES MF 10K 1/20W 5% 0201; MFG_NAME01: RALEC ELECTRONIC CORP; MFG_PN01: RTT01103JTH; EIA Case: 0201; Value: 10K; Tolerance: 5%; ROHS: Yes; PCB Footprint: 0201_CC; Rated Power: 1/20W
R125 = RES: RES MF 1.0K 1/20W 5% 0201; Temp Range: -55°C ~ 155°C; VOLTAGE: 25V; EIA Case: 0201; MFG_NAME01: WALSIN TECHNOLOGY CORP.; MFG_PN01: WR02X102 JAL; Value: 1K; Tolerance: 5%; ROHS: Yes; PCB Footprint: 0201_CC; Rated Power: 1/20W
U1 = MIMX8MM_BGA486P: as U1 on sheet 02-CPUPWR QCMI SOM; Value: MIMX8MM6DVTLZAA; ROHS: Yes; MFG_PN01: MIMX8MM6DVTLZAA; PCB Footprint: bga486_0p5_14x14; JEDEC Case: BGA486

## Sheet 05-CPUPHY QCMI SOM.SchDoc: CPU PHY
size 431 x 279 mm; CAGE_CODE: 8LSW1; Designer: B. Jordan; DsnPath: G:\My Drive\Quilter Computer - Engineering Assets\NXP i.MX8M-Mini\8MMINILPD4-CPU2-DESIGNFILES\8MMINILPD4-CPU2-DESIGNFILES\SCH-47712_A4.DSN; ApprovedBy: S. Nesterenko; CheckedBy: D. Gudino; Author: B. Jordan; CompanyName: Allegro Labs, Inc.; DrawnBy: B. Jordan; Engineer: B. Jordan; Address1: 29315 Stonecrest Rd; Address2: Rolling Hills Estates; Address3: CA, 90275; Address4: USA; DocumentNumber: QCMISM-SCH-05-0; Revision: 0; SheetNumber: 05; SheetTotal: 10; CHK_APP_DATE: --/--/--; DSN_APP_DATE: --/--/--; ENG_APP_DATE: --/--/--; DOC_NO_BOM: TBD; DOC_NO_ASSY_DWG: TBD; DOC_NO_FAB_DWG: TBD; DOC_NO_PCB_DWG: TBD
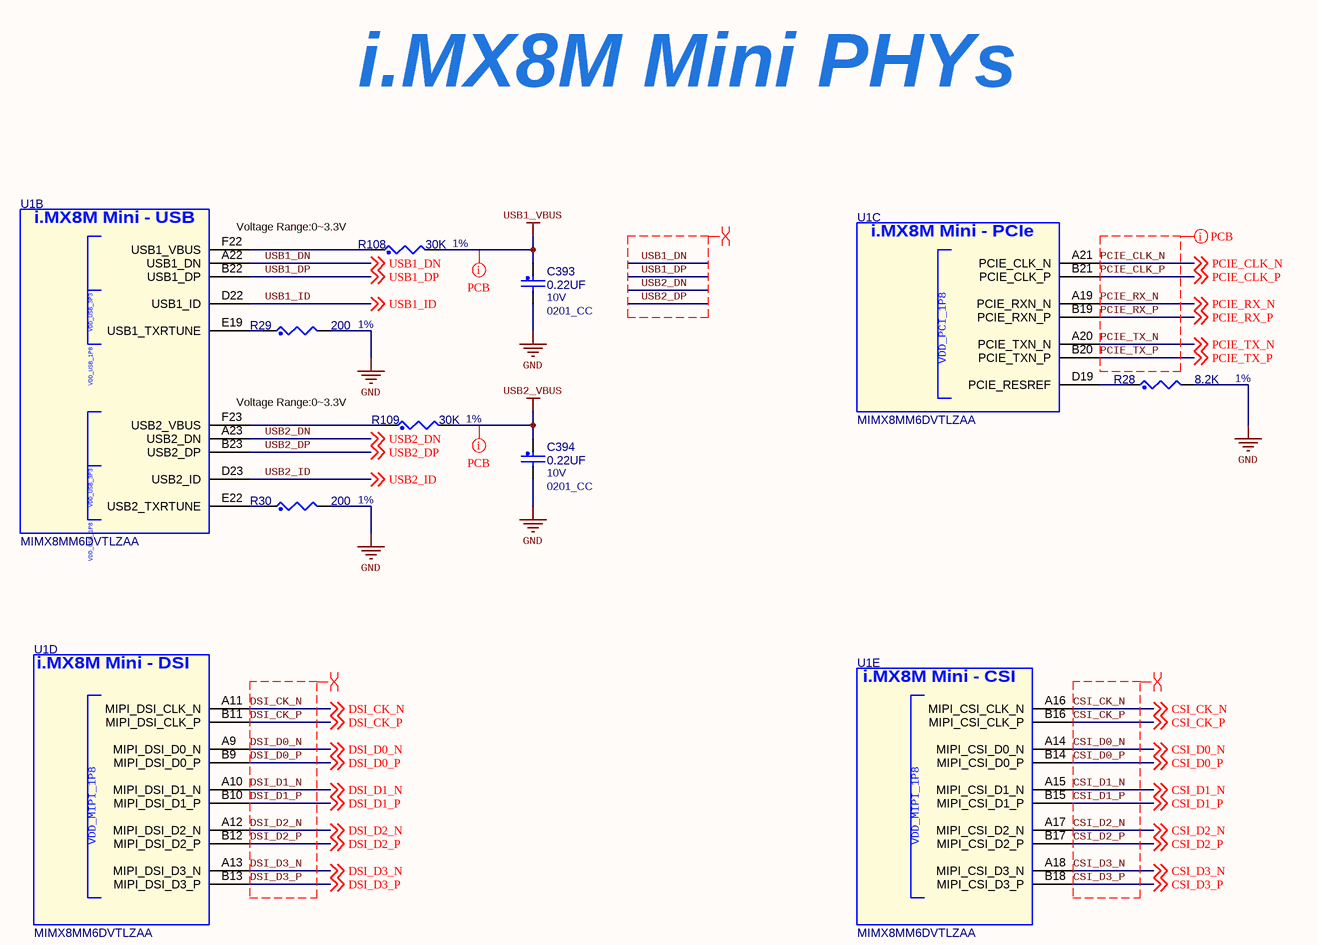
[diagram p4: 05-CPUPHY QCMI SOM.SchDoc]

### Parts
C393  0.22UF  VOLTAGE: 10V  [0201_CC]
C394  0.22UF  VOLTAGE: 10V  [0201_CC]
R28  8.2K  Tolerance: 1%  [0402_CC]
R29  200  Tolerance: 1%  [0201_CC]
R30  200  Tolerance: 1%  [0201_CC]
R108  30K  Tolerance: 1%  [0201_CC]
R109  30K  Tolerance: 1%  [0201_CC]
U1  MIMX8MM6DVTLZAA  [bga486_0p5_14x14]  (parts B,C,D,E of 14)

### Nets
GND: C393.2 C394.2 R28.2 R29.2 R30.2
USB1_VBUS: C393.1 R108.2
USB2_VBUS: C394.1 R109.2
CSI_CK_N: U1.A16(MIPI_CSI_CLK_N) ; off-sheet CSI_CK_N
CSI_CK_P: U1.B16(MIPI_CSI_CLK_P) ; off-sheet CSI_CK_P
CSI_D0_N: U1.A14(MIPI_CSI_D0_N) ; off-sheet CSI_D0_N
CSI_D0_P: U1.B14(MIPI_CSI_D0_P) ; off-sheet CSI_D0_P
CSI_D1_N: U1.A15(MIPI_CSI_D1_N) ; off-sheet CSI_D1_N
CSI_D1_P: U1.B15(MIPI_CSI_D1_P) ; off-sheet CSI_D1_P
CSI_D2_N: U1.A17(MIPI_CSI_D2_N) ; off-sheet CSI_D2_N
CSI_D2_P: U1.B17(MIPI_CSI_D2_P) ; off-sheet CSI_D2_P
CSI_D3_N: U1.A18(MIPI_CSI_D3_N) ; off-sheet CSI_D3_N
CSI_D3_P: U1.B18(MIPI_CSI_D3_P) ; off-sheet CSI_D3_P
DSI_CK_N: U1.A11(MIPI_DSI_CLK_N) ; off-sheet DSI_CK_N
DSI_CK_P: U1.B11(MIPI_DSI_CLK_P) ; off-sheet DSI_CK_P
DSI_D0_N: U1.A9(MIPI_DSI_D0_N) ; off-sheet DSI_D0_N
DSI_D0_P: U1.B9(MIPI_DSI_D0_P) ; off-sheet DSI_D0_P
DSI_D1_N: U1.A10(MIPI_DSI_D1_N) ; off-sheet DSI_D1_N
DSI_D1_P: U1.B10(MIPI_DSI_D1_P) ; off-sheet DSI_D1_P
DSI_D2_N: U1.A12(MIPI_DSI_D2_N) ; off-sheet DSI_D2_N
DSI_D2_P: U1.B12(MIPI_DSI_D2_P) ; off-sheet DSI_D2_P
DSI_D3_N: U1.A13(MIPI_DSI_D3_N) ; off-sheet DSI_D3_N
DSI_D3_P: U1.B13(MIPI_DSI_D3_P) ; off-sheet DSI_D3_P
PCIE_CLK_N: U1.A21(PCIE_CLK_N) ; off-sheet PCIE_CLK_N
PCIE_CLK_P: U1.B21(PCIE_CLK_P) ; off-sheet PCIE_CLK_P
PCIE_RX_N: U1.A19(PCIE_RXN_N) ; off-sheet PCIE_RX_N
PCIE_RX_P: U1.B19(PCIE_RXN_P) ; off-sheet PCIE_RX_P
PCIE_TX_N: U1.A20(PCIE_TXN_N) ; off-sheet PCIE_TX_N
PCIE_TX_P: U1.B20(PCIE_TXN_P) ; off-sheet PCIE_TX_P
USB1_DN: U1.A22(USB1_DN) ; off-sheet USB1_DN
USB1_DP: U1.B22(USB1_DP) ; off-sheet USB1_DP
USB1_ID: U1.D22(USB1_ID) ; off-sheet USB1_ID
USB2_DN: U1.A23(USB2_DN) ; off-sheet USB2_DN
USB2_DP: U1.B23(USB2_DP) ; off-sheet USB2_DP
USB2_ID: U1.D23(USB2_ID) ; off-sheet USB2_ID
NetR28_1: R28.1 U1.D19(PCIE_RESREF)
NetR29_1: R29.1 U1.E19(USB1_TXRTUNE)
NetR30_1: R30.1 U1.E22(USB2_TXRTUNE)
NetR108_1: R108.1 U1.F22(USB1_VBUS)
NetR109_1: R109.1 U1.F23(USB2_VBUS)

### Layout directives
differential pair; differential pair class CSI: CSI_CK_N, CSI_CK_P, CSI_D0_N, CSI_D0_P, CSI_D1_N, CSI_D1_P, CSI_D2_N, CSI_D2_P, CSI_D3_N, CSI_D3_P
differential pair; differential pair class USB: USB1_DN, USB1_DP, USB2_DN, USB2_DP
differential pair; differential pair class PCIE: PCIE_CLK_N, PCIE_CLK_P, PCIE_RX_N, PCIE_RX_P, PCIE_TX_N, PCIE_TX_P
rule Supply Nets [Voltage = 3.300]; net class POWER: USB1_VBUS, USB2_VBUS
differential pair; differential pair class DSI: DSI_CK_N, DSI_CK_P, DSI_D0_N, DSI_D0_P, DSI_D1_N, DSI_D1_P, DSI_D2_N, DSI_D2_P, DSI_D3_N, DSI_D3_P

### Notes on the sheet
- i.MX8M Mini PHYs
- Voltage Range:0~3.3V
- (near U1) Voltage Range:0~3.3V
- DWG. NO.
- REV.
- SHT.
- REVISION
- DESCRIPTION
- DATE
- APPROVED
- ENG:
- APPROVALS
- REFERENCE DOCUMENTS
- DSN:
- CHK:
- TITLE
- PROJECT
- BOM:
- ASSY DWG:
- FAB DWG:
- SIZE
- FILE NAME
- B
- SCHEMATIC DOCUMENT NUMBER
- SHEET
- OF
- REV
- PCB DWG:
- (in symbol MIMX8MM_BGA486P, part B) i.MX8M Mini - USB
- (in symbol MIMX8MM_BGA486P, part C) i.MX8M Mini - PCIe
- (in symbol MIMX8MM_BGA486P, part D) i.MX8M Mini - DSI
- (in symbol MIMX8MM_BGA486P, part E) i.MX8M Mini - CSI

### Library data of the parts
C393 C394 = CAP_NP: CAP CER 0.22UF 10V 20% X5R 0201; MFG_PN01: LMK063BJ224MP-F; MFG_NAME01: Taiyo Yuden; EIA Case: 0201; Value: 0.22UF; ROHS: Yes; Tolerance: 20%; PCB Footprint: 0201_CC
R28 = RES: RES MF 8.2K  1/10W 1% AEC-Q200 0402; MFG_NAME01: KOA SPEER; MFG_PN01: RK73H1ETTP8201F; EIA Case: 0402; Temp Range: -55°C ~ 155°C; Value: 8.2K; PCB Footprint: 0402_CC; ROHS: Yes; Rated Power: 1/10W
R29 R30 = RES: RES MF 200 OHM 1/20W 1% 0201; MFG_NAME01: YAGEO AMERICA; MFG_PN01: RC0201FR-07200RL; EIA Case: 0201; VOLTAGE: 25V; Temp Range: -55°C ~ 155°C; Value: 200; PCB Footprint: 0201_CC; ROHS: Yes; Rated Power: 1/20W
R108 = RES: RES MF 30K 1/20W 1% 0201; MFG_NAME01: YAGEO AMERICA; MFG_PN01: RC0201FR-0730KL; EIA Case: 0201; VOLTAGE: 25V; Temp Range: -55°C ~ 155°C; Value: 30K; PCB Footprint: 0201_CC; ROHS: Yes; Rated Power: 1/20W
R109 = RES: RES MF 30K 1/20W 1% 0201; MFG_PN01: RC0201FR-0730KL; MFG_NAME01: YAGEO AMERICA; EIA Case: 0201; VOLTAGE: 25V; Temp Range: -55°C ~ 155°C; Value: 30K; PCB Footprint: 0201_CC; ROHS: Yes; Rated Power: 1/20W
U1 = MIMX8MM_BGA486P: as U1 on sheet 02-CPUPWR QCMI SOM; Value: MIMX8MM6DVTLZAA; MFG_PN01: MIMX8MM6DVTLZAA; ROHS: Yes; PCB Footprint: bga486_0p5_14x14; JEDEC Case: BGA486